# EasyEDA Pro project hardware_project.epro, board PCB4
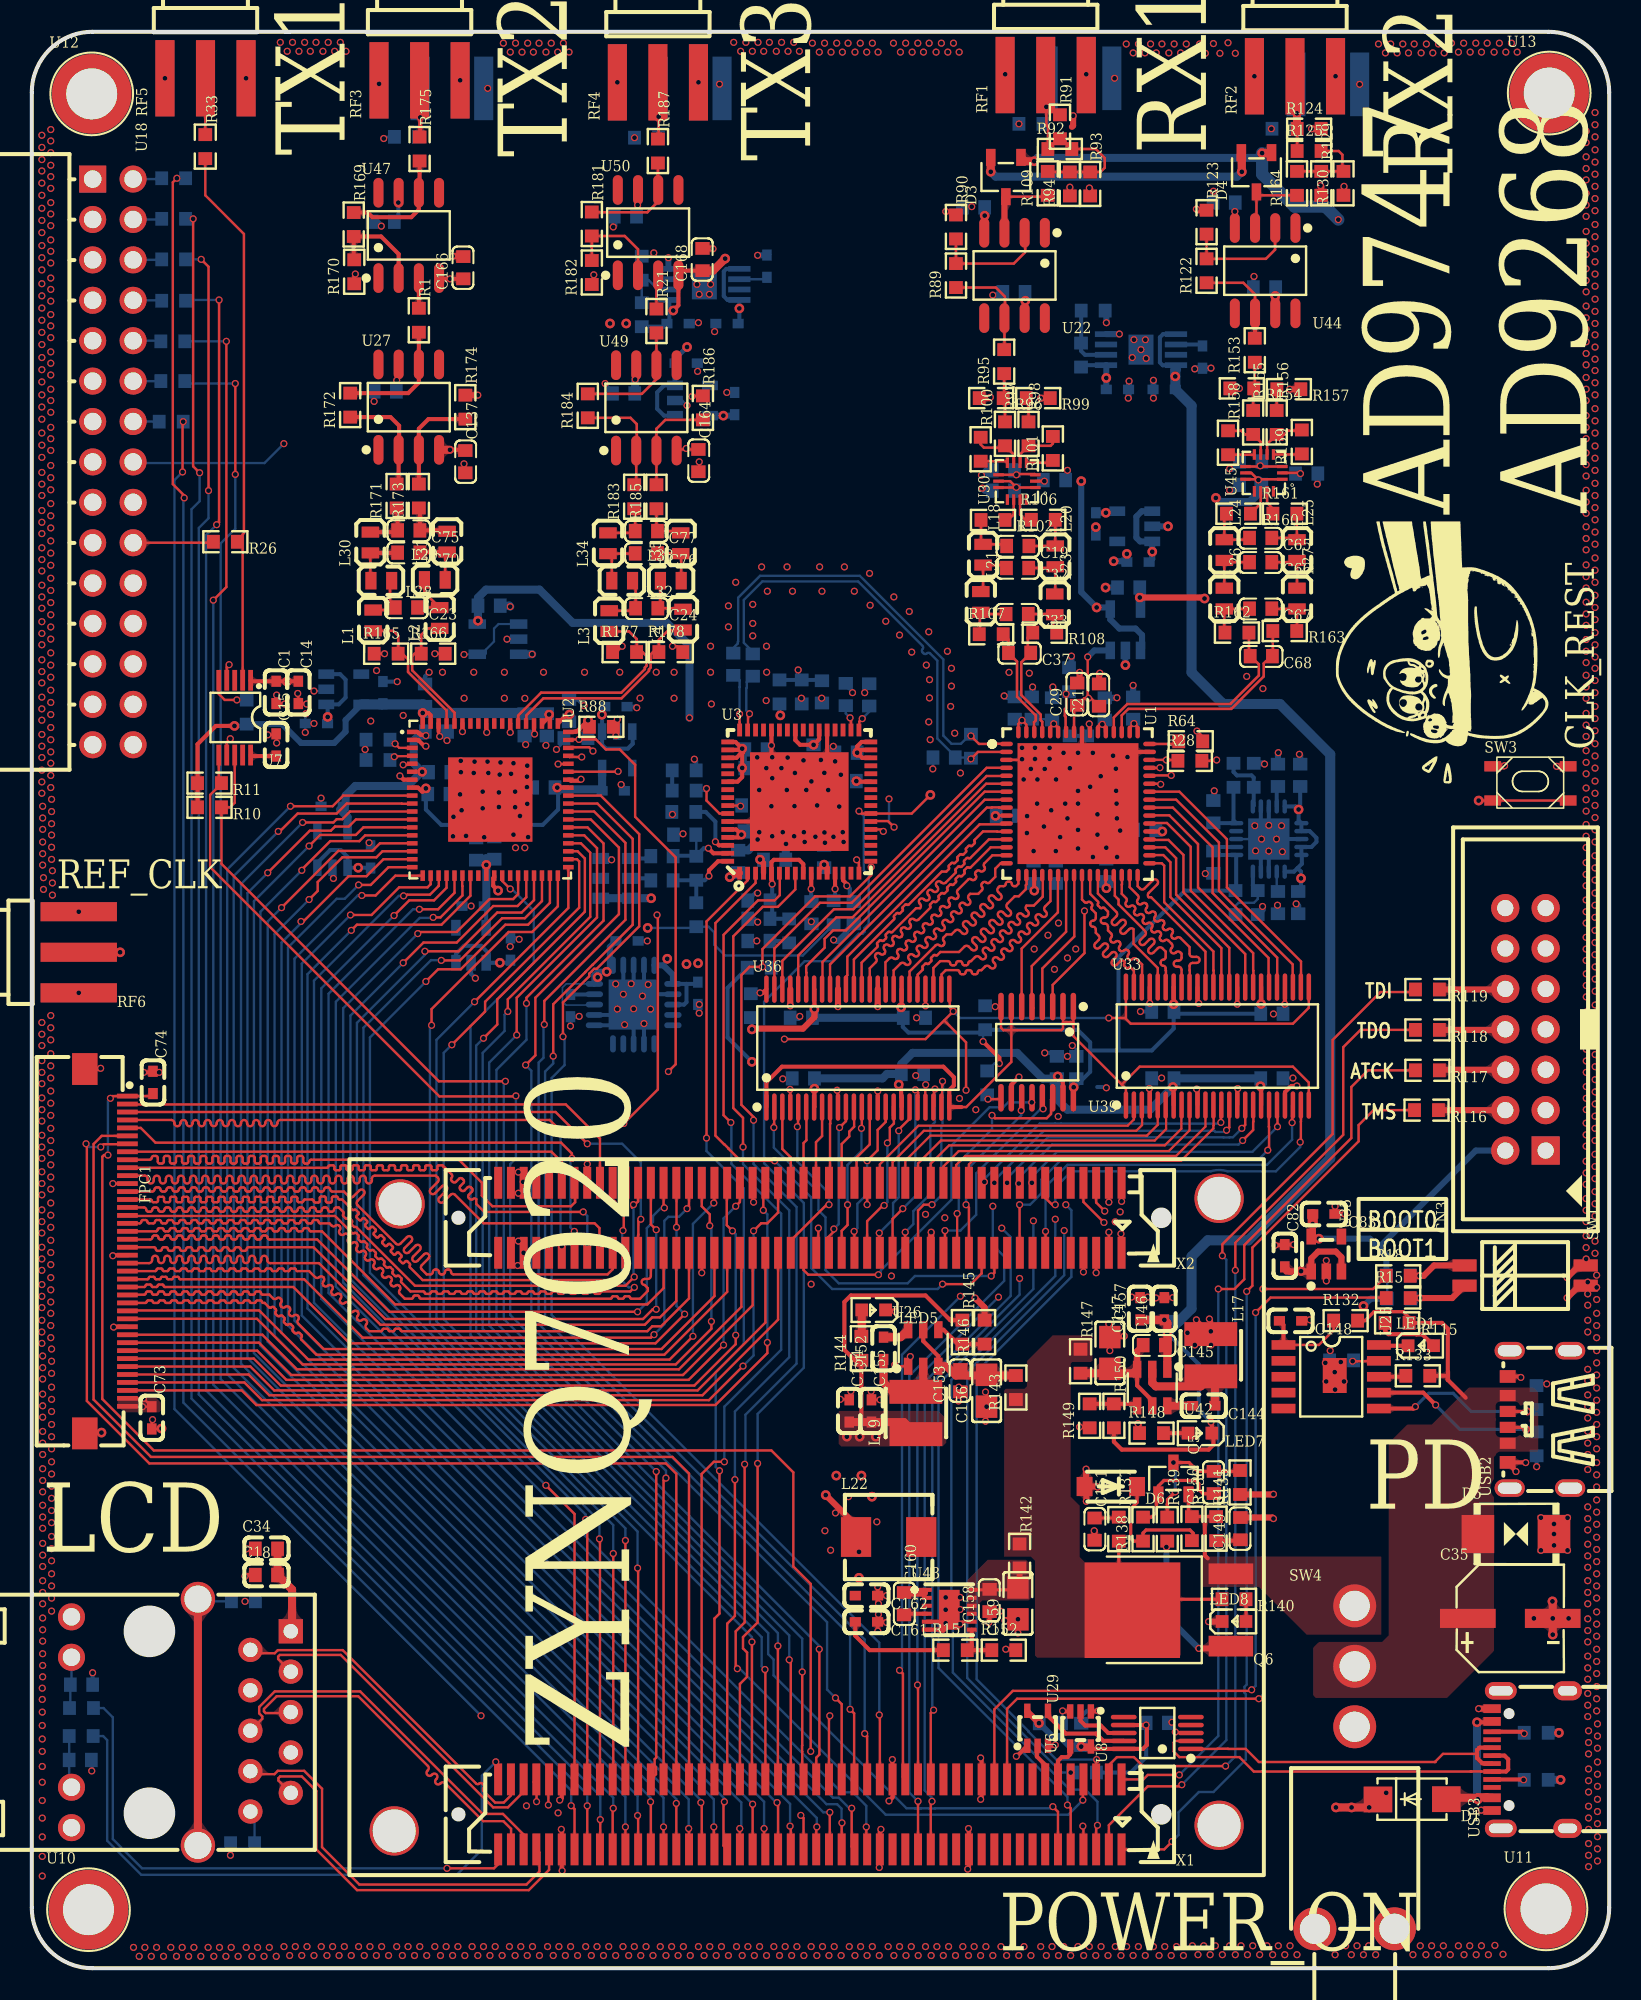
[diagram p7: board, top side]
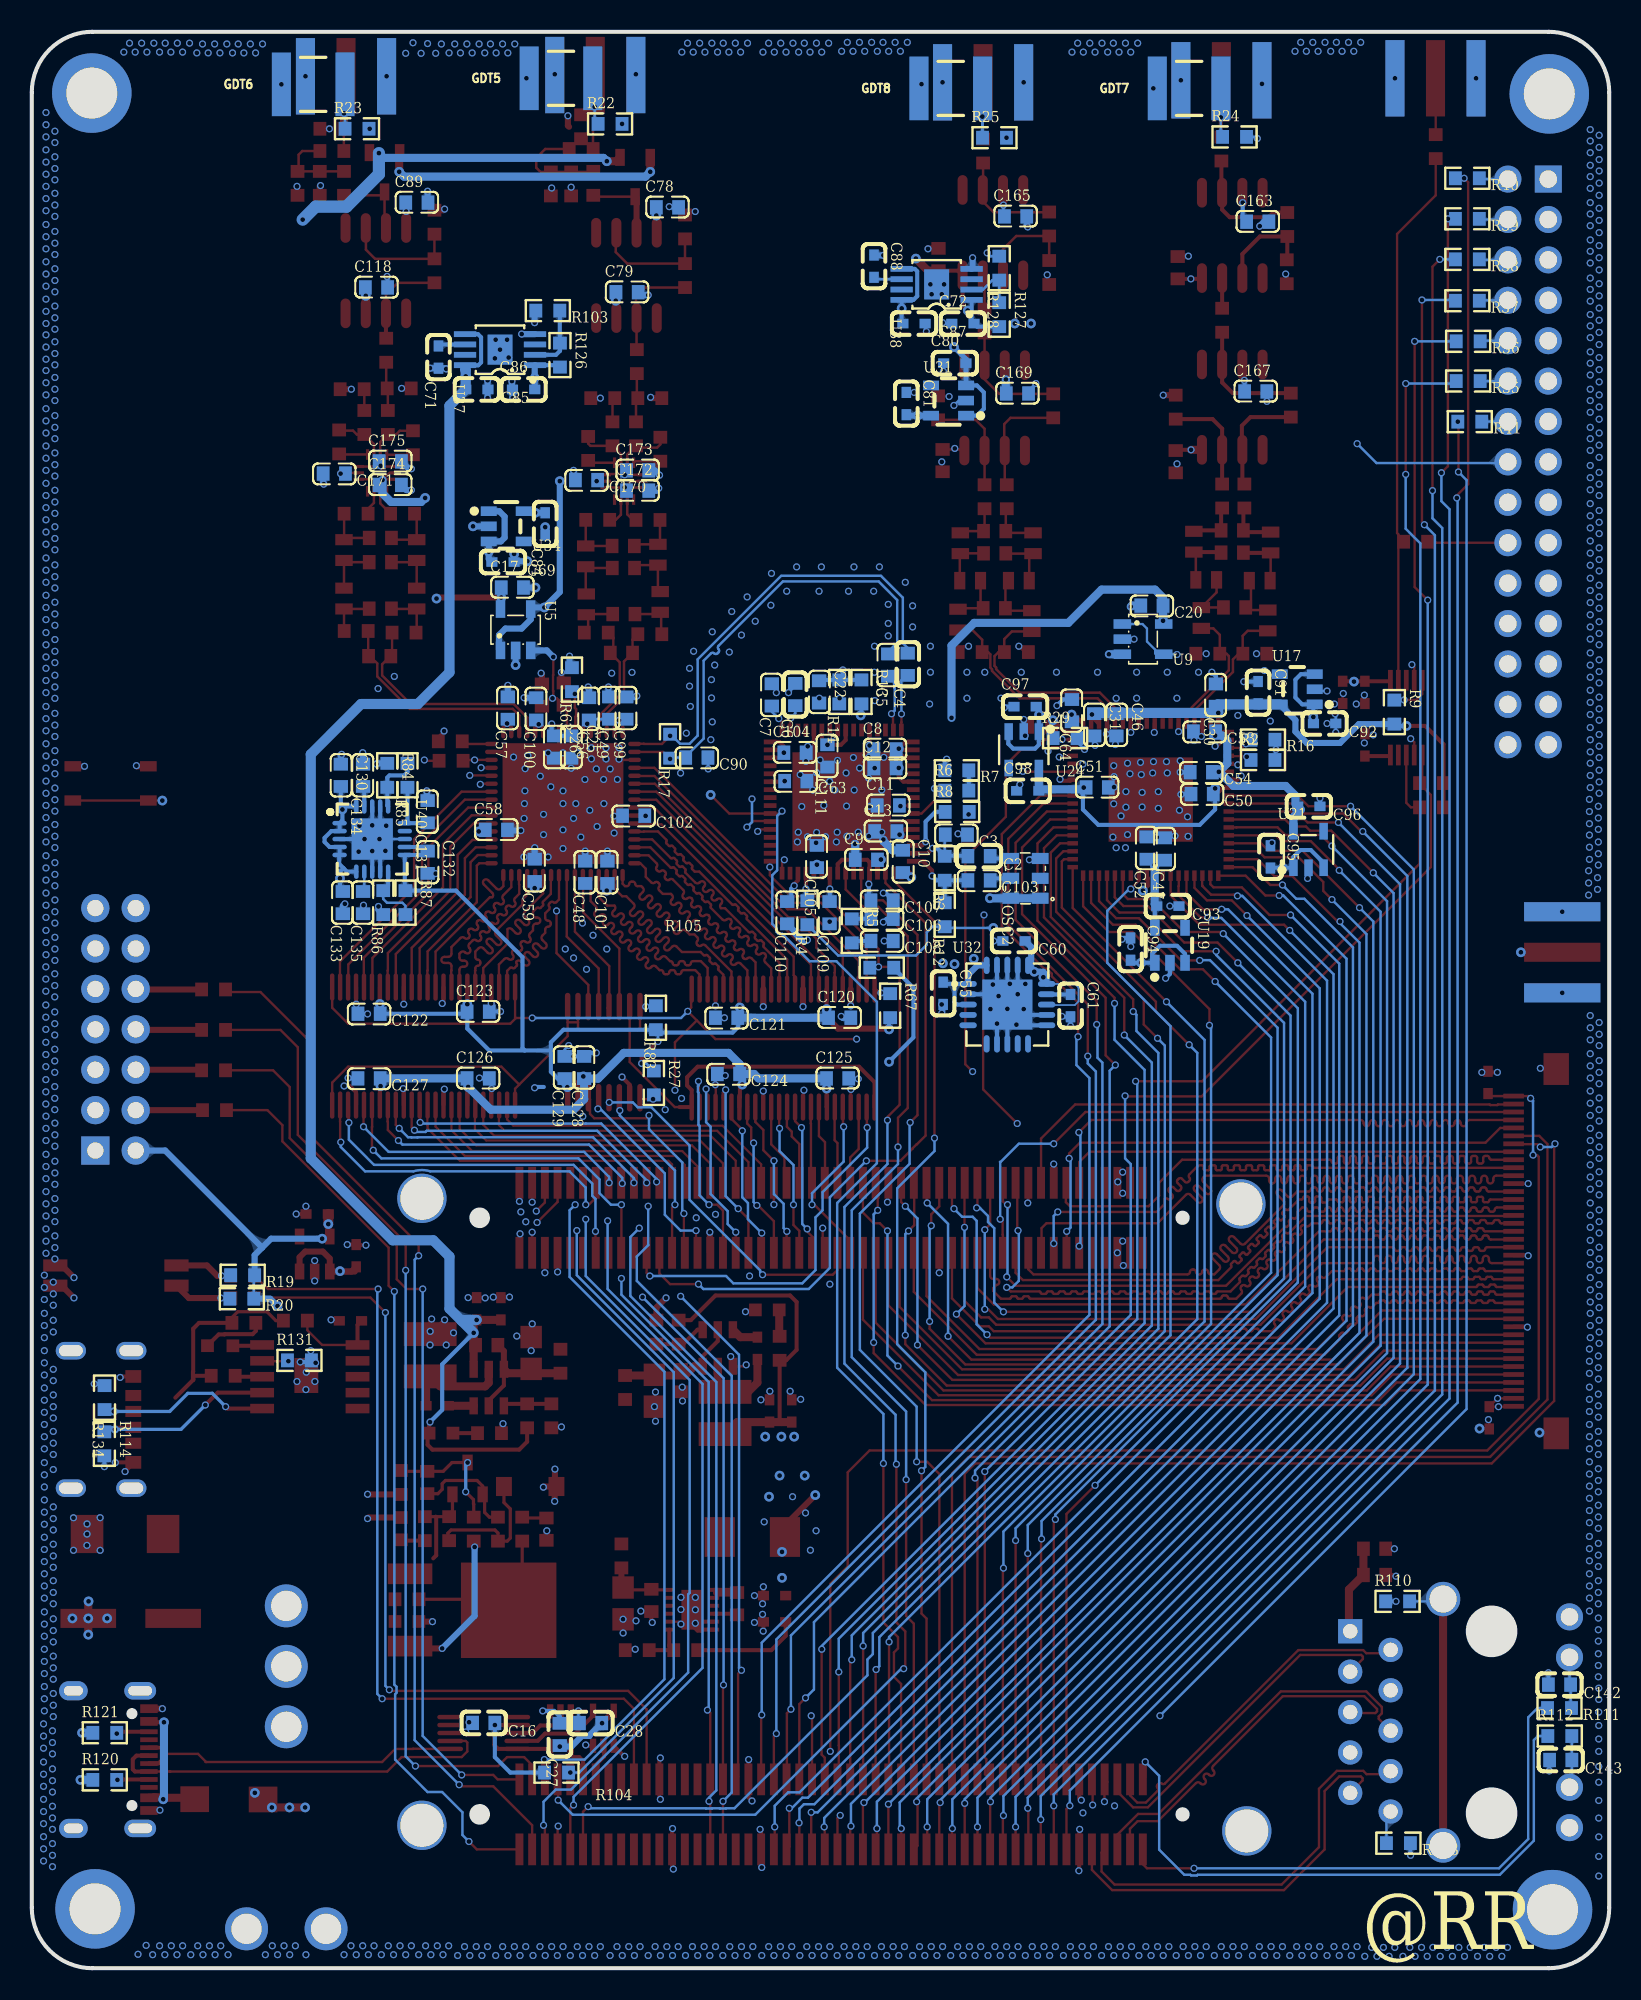
[diagram p8: board, bottom side, seen from below]

Outline 99.19 x 121.72 mm; copper layers: Top Layer, Inner1, Inner2, Inner3, Inner4, Bottom Layer. Coordinates in mm from the lower left corner of the outline.
Outline path: 0,117.91 0,3.81 arc(1.12,1.12) 3.81,0 95.38,0 arc(98.07,1.12) 99.19,3.81 99.19,117.91 arc(98.07,120.6) 95.38,121.72 3.81,121.72 arc(1.12,120.6) 0,117.91
Stack: Top Layer 0.035mm Outer layer thickness 1oz / Dielectric1 0.0994mm 3313 RC57% 4.2mil / Inner1 0.0152mm Inner layer thickness / Dielectric2 0.55mm 0.55mm H/H No copper / Inner2 0.0152mm Inner layer thickness / Dielectric3 0.1088mm 2116 RC54% 4.9mil / Inner3 0.0152mm Inner layer thickness / Dielectric4 0.55mm 0.55mm H/H No copper / Inner4 0.0152mm Inner layer thickness / Dielectric5 0.0994mm 3313 RC57% 4.2mil / Bottom Layer 0.035mm Outer layer thickness 1oz

## Design rules (mm)
net CLKP: DP6
net CLKN: DP6
net PHY1MDI3N: DP4
net PHY1MDI1N: DP2
net PHY1MDI3P: DP4
net PHY1MDI1P: DP2
net PHY1MDI2N: DP3
net PHY1MDI0N: DP1
net PHY1MDI2P: DP3
net PHY1MDI0P: DP1
spacing copperThickness1oz (default): track to track 0.102, other pairs 0.025 to 0.3
spacing safeClearance1: track to track 0.254, other pairs 0.152 to 0.3
spacing safeClearance2: track to track 0.152, other pairs 0.152 to 0.3
track width copperThickness1oz (default): min 0.025, default 0.254, max 2.54
track width GND: min 0.381, default 0.762, max 2.54
track width VCC: min 0.381, default 0.508, max 2.54
differential pair PHY (default): width min 0.102, default 0.119, max 2.54; gap min 0.102, default 0.203
differential pair differentialPair: width min 0.127, default 0.254, max 2.54; gap min 0.152, default 0.152
net GND uses copperRegion
pour e2939 uses copperRegion, copperThickness1oz
pour e542 uses copperRegion, copperThickness1oz
net PHY1MDI3N uses PHY
net PHY1MDI1N uses PHY
net PHY1MDI3P uses PHY
net PHY1MDI1P uses PHY
net PHY1MDI2N uses PHY
net PHY1MDI0N uses PHY
net PHY1MDI2P uses PHY
net PHY1MDI0P uses PHY
net PHY1AD1/LED1 uses default
net PHY1AD0/LED0 uses default
net VBUS uses copperRegion1, safeClearance1
net A-4.5V uses copperRegion
net A+2.5V uses copperRegion
net B35_L11_N        LCD_RST uses default
net B35_L7_N    LCD_BL uses default
net B34_L9_P       LCD_R6 uses default
net B34_L18_N      LCD_R1 uses default
net B34_L5_N       LCD_R3 uses default
net B34_L18_P      LCD_R0 uses default
net B34_L5_P       LCD_R2 uses default
net B34_L9_N       LCD_R7 uses default
net B34_L7_N      LCD_R4 uses default
net B34_L20_P       LCD_G2 uses default
net B34_L7_P      LCD_R5 uses default
net B34_L20_N       LCD_G3 uses default
net B34_L21_P     LCD_G0 uses default
net B34_L21_N     LCD_G1 uses default
net B34_L24_P       LCD_G6 uses default
net B34_L17_P     LCD_G4 uses default
net B34_L24_N       LCD_G7 uses default
net B34_L17_N     LCD_G5 uses default
net B34_L19_P       LCD_B2 uses default
net B34_L22_P     LCD_B0 uses default
net B34_L19_N       LCD_B3 uses default
net B34_L22_N     LCD_B1 uses default
net B34_L16_N     LCD_B4 uses default
net B34_L23_N       LCD_B6 uses default
net B34_L16_P     LCD_B5 uses default
net B34_L23_P       LCD_B7 uses default
net B34_L13_N      LCD_CLK uses default
net B34_L13_P    LCD_HSYNC uses default
net B34_L15_P       LCD_VSYNC uses default
net B34_L15_N       LCD_DE uses default
net 5.0V uses copperRegion

## Placement (name value [footprint] x y rotation side)
C1  10uF  [C0603#2]  15.36 80.19 270 top
C2  100nF  [C0603]  39.62 69.9 0 bottom
C3  100nF  [C0603]  41.05 71.25 0 bottom
C4  100nF  [C0603]  44.11 81.96 90 bottom
C5  100nF  [C0603]  45.33 81.91 90 bottom
C6  100nF  [C0603]  51.18 80.06 90 bottom
C7  100nF  [C0603]  52.65 80.04 90 bottom
C8  100nF  [C0603]  45.54 76.61 180 bottom
C9  100nF  [C0603]  46.71 69.67 180 bottom
C10  100nF  [C0603]  44.42 69.57 270 bottom
C11  100nF  [C0603]  45.33 73.09 180 bottom
C12  100nF  [C0603]  45.54 75.44 180 bottom
C13  100nF  [C0603]  45.49 71.46 180 bottom
C14  100nF  [C0603#2]  16.76 80.19 270 top
C15  220nF  [C0603#2]  15.36 76.89 270 top
C16  100n  [C0603]  70.77 15.42 0 bottom
C17  100nF  [C0603]  68.97 86.78 180 bottom
C18  100nF  [C0603]  14.75 24.72 0 top
C19  15pF  [C0603]  62 89.4 180 top
C20  100nF  [C0603]  28.75 85.65 0 bottom
C21  100nF  [C0603]  67.11 80.03 90 top
C22  100nF  [C0603]  49.68 80.22 270 bottom
C23  NC  [C0603]  23.56 85.53 180 top
C24  33pF  [C0603]  38.67 85.48 180 top
C25  100nF  [C0603]  65.27 76.76 270 bottom
C26  10uF  [C0603]  66.34 76.76 270 bottom
C27  100n  [C0603]  65.99 14.69 90 bottom
C28  100n  [C0603]  64.05 15.41 0 bottom
C29  10uF  [C0603]  65.73 80.09 90 top
C30  10uF  [C0603]  24.73 80.03 90 bottom
C31  100nF  [C0603]  32.39 78.16 270 bottom
C32  68pF  [C0603]  61.99 88.01 180 top
C33  130pF  [C0603]  61.96 85.12 180 top
C34  1uF  [C0603]  14.75 26.37 0 top
C35  220uF  [CAP-SMD_BD6.3-L6.6-W6.6-FD]  92.97 21.99 0 top
C37  11pF  [C0603]  62.11 82.68 180 top
C46  100nF  [C0603]  30.99 78.16 270 bottom
C47  10uF  [C0603]  27.94 70.35 90 bottom
C48  10uF  [C0603]  64.39 68.89 90 bottom
C49  10uF  [C0603]  62.88 79.21 90 bottom
C50  100nF  [C0603]  25.6 73.8 0 bottom
C51  100nF  [C0603]  32.2 74.22 180 bottom
C52  100nF  [C0603]  29.08 70.41 90 bottom
C53  100nF  [C0603]  25.44 77.73 0 bottom
C54  100nF  [C0603]  25.65 75.18 0 bottom
C55  10uF  [C0603#2]  41.88 61.28 270 bottom
C56  100nF  [C0603]  64.15 79.16 90 bottom
C57  100nF  [C0603]  69.25 79.21 90 bottom
C58  100nF  [C0603]  69.98 71.55 180 bottom
C59  100nF  [C0603]  67.56 69.01 90 bottom
C60  10uF  [C0603#2]  37.43 64.57 0 bottom
C61  100nF  [C0603#2]  33.87 60.51 270 bottom
C63  100nF  [C0603]  51.15 74.62 0 bottom
C64  100nF  [C0603]  33.78 79.05 90 bottom
C65  15pF  [C0603]  77.27 89.9 180 top
C66  68pF  [C0603]  77.27 88.38 180 top
C67  100pF  [C0603]  77.27 85.46 180 top
C68  11pF  [C0603]  77.31 82.47 180 top
C69  1uF  [C0603#2]  69.56 88.39 0 bottom
C70  NC  [C0603]  23.7 88.98 180 top
C71  10nF  [C0603#2]  73.61 101.27 90 bottom
C72  10uF  [C0603#2]  40.64 103.38 180 bottom
C73  100nF  [C0603#2]  7.54 34.59 270 top
C74  1uF  [C0603#2]  7.62 55.68 270 top
C75  NC  [C0603]  23.7 90.38 180 top
C76  47pF  [C0603]  38.64 88.94 180 top
C77  39pF  [C0603]  38.64 90.33 180 top
C78  100nF  [C0603]  59.22 110.68 180 bottom
C79  100nF  [C0603]  61.76 105.35 180 bottom
C80  1uF  [C0603#2]  41.15 100.89 180 bottom
C81  1uF  [C0603#2]  44.2 98.35 270 bottom
C82  1uF  [C0603#2]  78.79 44.78 270 top
C83  1uF  [C0603#2]  81.24 47.41 180 top
C84  1uF  [C0603#2]  66.91 90.79 90 bottom
C85  10uF  [C0603#2]  71.2 99.24 0 bottom
C86  10uF  [C0603#2]  68.26 99.24 180 bottom
C87  10uF  [C0603#2]  43.71 103.38 0 bottom
C88  10nF  [C0603#2]  46.23 106.98 270 bottom
C89  100nF  [C0603]  74.97 110.98 180 bottom
C90  100nF  [C0603]  57.37 76.1 0 bottom
C91  1uF  [C0603#2]  22.08 80.18 270 bottom
C92  1uF  [C0603#2]  17.89 78.24 0 bottom
C93  1uF  [C0603#2]  27.75 66.76 0 bottom
C94  1uF  [C0603#2]  30.1 64.06 270 bottom
C95  1uF  [C0603#2]  21.3 69.86 270 bottom
C96  1uF  [C0603#2]  18.89 73.03 0 bottom
C97  1uF  [C0603#2]  36.73 79.3 180 bottom
C98  1uF  [C0603#2]  36.56 74.01 180 bottom
C99  100nF  [C0603]  61.81 79.21 90 bottom
C100  100nF  [C0603]  67.47 79.16 90 bottom
C101  100nF  [C0603]  62.99 68.89 90 bottom
C102  100nF  [C0603]  61.34 72.44 0 bottom
C103  100nF  [C0603]  39.62 68.38 0 bottom
C104  100nF  [C0603]  51.2 76.4 180 bottom
C105  10uF  [C0603]  49.82 69.88 90 bottom
C106  680pF  [C0603]  45.72 65.96 0 bottom
C107  17pF  [C0603]  45.72 67.11 0 bottom
C108  3.51nF  [C0603]  45.72 64.57 0 bottom
C109  220nF  [C0603]  49.02 66.34 90 bottom
C110  220nF  [C0603]  51.69 66.34 90 bottom
C111  100nF  [C0603]  49.16 76.2 90 bottom
C118  100nF  [C0603]  77.51 105.65 180 bottom
C120  100nF  [C0603]  48.39 59.74 180 bottom
C121  100nF  [C0603]  55.5 59.74 0 bottom
C122  100nF  [C0603]  77.98 60 0 bottom
C123  100nF  [C0603]  71.12 60.12 180 bottom
C124  100nF  [C0603]  55.38 56.21 0 bottom
C125  100nF  [C0603]  48.51 55.93 180 bottom
C126  100nF  [C0603]  71.12 55.93 180 bottom
C127  100nF  [C0603]  77.98 55.93 0 bottom
C128  100nF  [C0603]  64.46 56.62 90 bottom
C129  100nF  [C0603]  65.68 56.62 90 bottom
C130  10uF  [C0603]  79.76 74.98 270 bottom
C131  10uF  [C0603]  74.3 72.7 90 bottom
C132  10uF  [C0603]  74.3 69.52 270 bottom
C133  10uF  [C0603]  79.63 66.98 90 bottom
C134  10nF  [C0603]  78.36 74.98 90 bottom
C135  10nF  [C0603]  78.36 66.98 90 bottom
C137  100nF  [C0603]  27.26 94.7 270 top
C142  100nF  [C0603]  3.12 17.82 0 bottom
C143  100nF  [C0603]  3.05 13.09 0 bottom
C144  100nF  [C0603#2]  73.69 35.35 180 top
C145  10uF  [C0603]  70.58 39.16 180 top
C146  22uF  [C0603#2]  71.22 41.45 90 top
C147  22uF  [C0603#2]  69.69 41.45 90 top
C148  1uF  [C0603#2]  79.15 40.69 180 top
C149  10nF  [C0603]  75.99 27.63 90 top
C150  100nF  [C0603]  74.33 30.53 90 top
C151  10nF  [C0603]  66.83 27.6 270 top
C152  100nF  [C0603#2]  53.56 38.96 90 top
C153  100nF  [C0603]  58.39 36.93 90 top
C154  22uF  [C0603#2]  51.4 35.03 270 top
C155  22uF  [C0603#2]  52.8 35.03 270 top
C156  22uF  [C0805]  60.04 36.3 90 top
C157  22uF  [C0805]  67.79 38.67 270 top
C158  100nF  [C0603]  60.23 23.12 90 top
C159  22uF  [C0805]  62.01 22.93 90 top
C160  100nF  [C0603]  54.84 22.91 270 top
C161  22uF  [C0603#2]  52.48 21.77 180 top
C162  22uF  [C0603#2]  52.48 23.42 180 top
C163  100nF  [C0603]  22.1 109.78 180 bottom
C164  100nF  [C0603]  41.92 94.76 270 top
C165  100nF  [C0603]  37.33 110.12 180 bottom
C166  100nF  [C0603]  27.13 106.89 90 top
C167  100nF  [C0603]  22.22 99.11 180 bottom
C168  100nF  [C0603]  42.17 107.4 90 top
C169  100nF  [C0603]  37.21 98.98 180 bottom
C170  100nF  [C0603]  64.3 93.54 0 bottom
C171  100nF  [C0603]  80.17 93.95 0 bottom
C172  100nF  [C0603]  61.09 92.88 180 bottom
C173  100nF  [C0603]  61.09 94.15 180 bottom
C174  100nF  [C0603]  76.65 93.23 180 bottom
C175  100nF  [C0603]  76.65 94.71 180 bottom
CN3  LAIL-SI-2.54-2X7P-ZC  [IDC-TH_14P-P2.54-V-M-R2-C7-S2.54]  93.92 59.02 90 top
D1  SS34  [SMA_L4.3-W2.6-LS5.0-FD]  86.8 10.61 180 top
D3  BAV99,215  [SOT-23-3_L2.9-W1.6-P1.90-LS2.8-BR]  61.25 112.59 90 top
D4  BAV99,215  [SOT-23-3_L2.9-W1.6-P1.90-LS2.8-BR]  77.01 112.89 90 top
D5  SMBJ24CA  [SMB_L4.6-W3.6-LS5.3-BI]  93.32 27.29 0 top
D6  SMF20A  [SOD-123F_L2.8-W1.8-LS3.7-RD]  67.85 30.28 180 top
FPC1  AFC01-S40FCA-00  [FPC-SMD_AFC01-S40FCA-00]  4.67 45.07 270 top
GDT5  GDT_SG90  [ScopefunPackagesLibrary:GDT_SG]  65.91 118.8 0 bottom
GDT6  GDT_SG90  [ScopefunPackagesLibrary:GDT_SG]  81.49 118.41 0 bottom
GDT7  GDT_SG90  [ScopefunPackagesLibrary:GDT_SG]  26.42 118.16 0 bottom
GDT8  GDT_SG90  [ScopefunPackagesLibrary:GDT_SG]  41.4 118.16 0 bottom
L1  0  [IND-SMD_L1.8-W1.2]  21.46 84.72 90 top
L2  0  [IND-SMD_L1.8-W1.2]  25.65 84.87 90 top
L3  0  [IND-SMD_L1.8-W1.2]  36.31 84.68 90 top
L4  0  [IND-SMD_L1.8-W1.2]  40.95 84.77 90 top
L17  10uH  [IND-SMD_L3.0-W3.0]  74.14 38.53 270 top
L18  56nH  [IND-SMD_L1.8-W1.2]  59.82 88.85 270 top
L19  10uH  [IND-SMD_L3.0-W3.0]  55.59 34.9 90 top
L20  56nH  [IND-SMD_L1.8-W1.2]  64.36 88.75 270 top
L21  120nH  [IND-SMD_L1.8-W1.2]  59.67 85.88 270 top
L22  3.3uH  [IND-SMD_L5.5-W5.3_APS0530M3R3H]  53.88 27.1 0 top
L23  120nH  [IND-SMD_L1.8-W1.2]  64.32 85.73 270 top
L24  56nH  [IND-SMD_L1.8-W1.2]  74.98 89.14 270 top
L25  56nH  [IND-SMD_L1.8-W1.2]  79.56 89.14 270 top
L26  120nH  [IND-SMD_L1.8-W1.2]  74.98 86.09 270 top
L27  120nH  [IND-SMD_L1.8-W1.2]  79.56 86.09 270 top
L28  0  [IND-SMD_L1.8-W1.2]  21.97 87.22 180 top
L29  0  [IND-SMD_L1.8-W1.2]  25.34 87.27 0 top
L30  0  [IND-SMD_L1.8-W1.2]  21.29 89.62 90 top
L31  0  [IND-SMD_L1.8-W1.2]  26.12 89.67 90 top
L32  0  [IND-SMD_L1.8-W1.2]  37.12 87.22 180 top
L33  0  [IND-SMD_L1.8-W1.2]  40.18 87.22 0 top
L34  0  [IND-SMD_L1.8-W1.2]  36.23 89.57 90 top
L35  0  [IND-SMD_L1.8-W1.2]  40.8 89.57 90 top
LED1  XL-2012SURC  [LED0603-RD_WHITE]  87.34 39.13 0 top
LED5  NCD0603Y2  [LED0603-RD]  52.94 41.38 180 top
LED7  NCD0603Y2  [LED0603-RD]  73.45 33.63 180 top
LED8  NCD0603Y2  [LED0603-RD]  75.6 21.79 0 top
NOREF  -  [Pad_e7144]  74.66 8.98 90 top
NOREF#2  -  [Pad_e7143]  74.66 48.39 0 top
NOREF#3  -  [Pad_e7142]  23.16 48.04 90 top
NOREF#4  -  [Pad_e7141]  22.79 8.63 90 top
OSC2  50MHz  [OSC-SMD_6P-L3.2-W2.5-BL-1]  36.7 68.5 90 bottom
Q5  MMBT3906  [SOT-23-3_L2.9-W1.3-P1.90-LS2.4-BR]  71.79 30.78 270 top
Q6  NCE40P70K  [TO-252-2_L6.6-W6.1-P4.57-LS9.9-TL-CW]  72.11 22.52 180 top
R1  50  [R0603]  24.34 103.59 270 top
R2  50  [R0603]  21.77 75.95 180 bottom
R3  100  [R0603]  41.78 69.14 90 bottom
R4  22  [R0603]  50.42 66.34 90 bottom
R5  1.09K  [R0603]  47.62 65.2 270 bottom
R6  3.9K  [R0603]  41.02 74.02 180 bottom
R7  220  [R0603]  41.02 75.29 0 bottom
R8  5.1K  [R0603]  41 72.68 180 bottom
R9  10K  [R0603]  13.51 78.95 270 bottom
R10  4.7K  [R0603]  11.17 72.97 180 top
R11  4.7K  [R0603]  11.17 74.49 180 top
R12  0  [R0603]  41.78 66.22 90 bottom
R13  36K  [R0603]  47.02 80.22 270 bottom
R14  5K  [R0603]  48.41 80.22 90 bottom
R15  20K  [R0603]  85.92 42.12 0 top
R16  50  [R0603]  21.77 77.22 0 bottom
R17  100  [R0603]  59.05 76.81 90 bottom
R18  20K  [R0603]  85.92 43.52 0 top
R19  20K  [R0603]  85.93 43.56 0 bottom
R20  20K  [R0603]  85.98 42.08 0 bottom
R21  50  [R0603]  39.28 103.54 270 top
R22  0Ω  [R0603]  62.83 115.93 180 bottom
R23  0Ω  [R0603]  78.74 115.62 180 bottom
R24  0Ω  [R0603]  23.56 115.11 180 bottom
R25  0Ω  [R0603]  38.65 115.06 180 bottom
R26  0Ω  [R0603]  12.17 89.66 180 top
R27  4.7K  [R0603]  60.07 55.65 270 bottom
R28  10K  [R0603]  72.82 75.89 0 top
R29  10K  [R0603]  34.21 77.32 180 bottom
R33  0Ω  [R0603]  10.91 114.5 270 top
R35  100  [R0603]  8.87 99.76 0 bottom
R36  100  [R0603]  8.87 102.26 0 bottom
R37  100  [R0603]  8.92 104.81 0 bottom
R38  100  [R0603]  8.92 107.41 0 bottom
R39  100  [R0603]  8.92 109.96 0 bottom
R40  100  [R0603]  8.92 112.51 0 bottom
R41  100  [R0603]  8.77 97.21 0 bottom
R63  10K  [R0603]  65.22 80.99 90 bottom
R64  10K  [R0603]  72.87 77.12 0 top
R67  4.7K  [R0603]  45.21 60.5 270 bottom
R83  4.7K  [R0603]  59.94 59.74 90 bottom
R84  1.6k  [R0603]  76.83 74.98 270 bottom
R85  2K  [R0603]  75.56 74.98 90 bottom
R86  1.6k  [R0603]  77.09 66.98 90 bottom
R87  2K  [R0603]  75.69 66.98 270 bottom
R88  10K  [R0603]  35.81 78.03 0 top
R89  0  [R0603]  58.11 106.4 90 top
R90  NC  [R0603]  58.11 109.45 270 top
R91  75  [R0603]  64.65 115.75 270 top
R92  120  [R0603]  64.64 114.35 0 top
R93  75  [R0603]  66.55 112.16 270 top
R94  49.9  [R0603]  65.27 112.16 90 top
R95  0  [R0603]  61.14 100.99 90 top
R96  62  [R0603]  60.33 98.69 180 top
R97  191  [R0603]  61.19 96.45 270 top
R98  191  [R0603]  62.67 96.45 270 top
R99  27.7  [R0603]  63.28 98.69 180 top
R100  200  [R0603]  59.66 95.48 270 top
R101  200  [R0603]  64.2 95.53 90 top
R102  24  [R0603]  60.44 91.03 180 top
R103  10K  [R0603]  66.74 104.19 0 bottom
R104  10K  [R0603]  66.19 12.3 0 bottom
R105  10K  [R0603]  45.74 62.89 180 bottom
R106  24  [R0603]  63.6 91.04 0 top
R107  0  [R0603]  60.33 83.85 0 top
R108  0  [R0603]  63.69 83.95 180 top
R109  120  [R0603]  63.88 112.19 90 top
R110  1  [R0603]  13.3 23.06 180 bottom
R111  330  [R0603]  3.12 16.35 0 bottom
R112  240  [R0603]  3.1 14.59 180 bottom
R113  0  [R0603]  13.25 7.86 0 bottom
R114  5.1kΩ  [R0603]  94.62 32.96 270 bottom
R115  20K  [R0603]  85.85 40.56 180 top
R116  33R  [R0603]  87.7 53.94 180 top
R117  33R  [R0603]  87.76 56.44 180 top
R118  33R  [R0603]  87.76 58.98 180 top
R119  33R  [R0603]  87.76 61.52 180 top
R120  5.1K  [R0603]  94.6 11.84 180 bottom
R121  5.1K  [R0603]  94.6 14.8 180 bottom
R122  0  [R0603]  73.87 106.69 90 top
R123  NC  [R0603]  73.87 109.75 270 top
R124  75  [R0603]  80.32 115.62 0 top
R125  120  [R0603]  80.32 114.22 0 top
R126  12K  [R0603]  65.98 101.4 270 bottom
R127  27K  [R0603]  38.35 103.94 270 bottom
R128  9.1K  [R0603]  38.35 106.86 90 bottom
R129  75  [R0603]  81.08 112.19 270 top
R130  49.9  [R0603]  82.48 112.19 90 top
R131  NC  [R0603]  82.36 38.21 180 bottom
R132  1K  [R0603]  82.61 40.7 0 top
R133  10K  [R0603]  87.15 37.24 0 top
R134  5.1kΩ  [R0603]  94.61 35.87 90 bottom
R135  33  [R0603]  74.47 27.63 270 top
R136  100K  [R0603]  72.95 27.63 270 top
R137  33  [R0603]  68.35 27.6 270 top
R138  1K  [R0603]  69.87 27.6 90 top
R139  1K  [R0603]  71.4 27.6 270 top
R140  33K  [R0603]  75.6 23.19 180 top
R141  10K  [R0603]  75.98 30.53 90 top
R142  0Ω  [R0603]  62.11 25.91 270 top
R143  0Ω  [R0603]  61.88 36.5 90 top
R144  4.3K  [R0603]  52.16 38.96 90 top
R145  102K  [R0603]  58.51 39.98 270 top
R146  24K  [R0603]  59.91 39.98 90 top
R147  0Ω  [R0603]  65.94 38.15 270 top
R148  4.3K  [R0603]  70.41 33.63 0 top
R149  180K  [R0603]  66.52 34.72 90 top
R150  24K  [R0603]  68.04 34.72 270 top
R151  51K  [R0603]  58.07 19.99 0 top
R152  10K  [R0603]  61.12 19.99 0 top
R153  0  [R0603]  76.9 101.7 90 top
R154  62  [R0603]  76.09 99.3 180 top
R155  191  [R0603]  76.8 97.16 270 top
R156  191  [R0603]  78.28 97.16 270 top
R157  27.7  [R0603]  79.04 99.25 180 top
R158  200  [R0603]  75.22 95.89 270 top
R159  200  [R0603]  79.86 95.94 90 top
R160  24  [R0603]  75.87 91.43 180 top
R161  24  [R0603]  78.8 91.43 0 top
R162  0  [R0603]  75.78 83.95 0 top
R163  0  [R0603]  78.79 84.05 180 top
R164  120  [R0603]  79.56 112.19 90 top
R165  49.9  [R0603]  22.28 82.63 0 top
R166  49.9  [R0603]  25.24 82.63 0 top
R169  1K  [R0603]  20.24 109.61 270 top
R170  1K  [R0603]  20.27 106.63 90 top
R171  250  [R0603]  22.94 92.54 90 top
R172  300  [R0603]  20.02 98.25 90 top
R173  50  [R0603]  24.34 92.54 90 top
R174  100  [R0603]  27.26 98.12 270 top
R175  50  [R0603]  24.38 114.35 270 top
R177  49.9  [R0603]  37.27 82.73 0 top
R178  49.9  [R0603]  40.18 82.73 0 top
R181  1K  [R0603]  35.21 109.64 270 top
R182  1K  [R0603]  35.21 106.59 90 top
R183  250  [R0603]  37.88 92.49 90 top
R184  300  [R0603]  34.96 98.21 90 top
R185  50  [R0603]  39.28 92.49 90 top
R186  100  [R0603]  42.2 98.08 270 top
R187  50  [R0603]  39.37 114.22 270 top
RF1  -  [SMA-SMD_BWSMA-KE-P001]  63.75 119 90 top
RF2  -  [SMA-SMD_BWSMA-KE-P001]  79.43 118.92 90 top
RF3  -  [SMA-SMD_BWSMA-KE-P001]  24.38 118.67 90 top
RF4  -  [SMA-SMD_BWSMA-KE-P001]  39.37 118.54 90 top
RF5  -  [SMA-SMD_BWSMA-KE-P001]  10.92 118.8 90 top
RF6  -  [SMA-SMD_BWSMA-KE-P001]  2.95 63.86 180 top
RJ1  HR911130A  [RJ45-TH_HR911130A]  9.39 15.46 90 top
SW1  DSHP02TSGER  [SW-SMD_DSHP02TSGER]  93.9 43.54 270 top
SW3  -  [4脚平脚开关]  94.23 74.47 0 top
SW4  MT-0-102-C004-N004-RS  [SW-TH_MT-0-102-C004-N004-RS]  83.18 12.62 0 top
U1  AD9268BCPZ-125  [LFCSP-64_L9.0-W9.0-P0.50-BL-EP7.5]  65.79 73.2 270 top
U2  AD9747BCPZRL  [LFCSP-72_L10.0-W9.8-P0.50-LS10.2-BL-EP5.5]  28.83 73.46 270 top
U3  AD9516-3BCPZ-REEL7  [LFCSP-64_L9.0-W9.0-P0.50-BL-EP6.2]  48.26 73.33 0 top
U5  OPA320AIDBVR  [SOT-23-5_L3.0-W1.7-P0.95-LS2.8-BR]  68.77 84.13 270 bottom
U6  74LVC1G125GW-TP  [SC-70-5_L2.1-W1.3-P0.65-LS2.1-BR]  65.94 15.04 90 top
U7  DAC60501MDGSR  [VSSOP-10_L3.0-W3.0-P0.50-LS4.9-BL]  12.76 78.61 180 top
U8  CH340X  [MSOP-10_L3.0-W3.0-P0.50-LS5.0-BL]  70.77 14.78 90 top
U9  OPA320AIDBVR  [SOT-23-5_L3.0-W1.7-P0.95-LS2.8-BR]  29.31 83.54 0 bottom
U10  M3x10+6Cu  [SMD_L4.7-W4.7-D3.0]  3.56 3.68 0 top
U11  M3x10+6Cu  [SMD_L4.7-W4.7-D3.0]  95.21 3.73 0 top
U12  M3x10+6Cu  [SMD_L4.7-W4.7-D3.0]  3.77 117.82 0 top
U13  M3x10+6Cu  [SMD_L4.7-W4.7-D3.0]  95.42 117.87 0 top
U17  TPS7A2033PDBVR  [SOT-23-5_L2.9-W1.6-P0.95-LS2.8-BR]  19.62 80.39 180 bottom
U18  HC-PM254-8.5H-2x15PW  [HDR-TH_30P-P2.54-H-F-R2-C15-W8.5]  5.1 94.68 270 top
U19  TPS7A2033PDBVR  [SOT-23-5_L2.9-W1.6-P0.95-LS2.8-BR]  27.62 64.3 270 bottom
U21  TPS7A2018PDBVR  [TSOT-23-5_L2.9-W1.6-P0.95-LS2.8-BL]  18.91 70.32 180 bottom
U22  LMH6609MAX/NOPB  [SOP-8_L4.9-W3.9-P1.27-LS6.0-BL]  61.8 106.4 180 top
U24  TPS7A2018PDBVR  [TSOT-23-5_L2.9-W1.6-P0.95-LS2.8-BL]  36.81 76.59 0 bottom
U25  CH224K  [ESSOP-10_L4.9-W3.9-P1.0-LS6.0-TL-EP]  81.71 37.18 270 top
U26  LMR51420XDDCR  [SOT-23-6_L2.9-W1.6-P0.95-LS2.8-BL]  56.05 38.98 0 top
U27  LMH6609MAX/NOPB  [SOP-8_L4.9-W3.9-P1.27-LS6.0-BL]  23.7 98.12 0 top
U29  74LVC1G125GW-TP  [SC-70-5_L2.1-W1.3-P0.65-LS2.1-BR]  63.25 15.08 270 top
U30  LMH6554LEE/NOPB  [UQFN-14_L2.5-W2.5-P0.40-BL]  61.94 93.47 90 top
U31  TPS7A2045PDBVR  [SOT-23-5_L2.9-W1.6-P0.95-LS2.8-BR]  41.54 98.54 180 bottom
U32  TPS7A4701RGWR  [VQFN-20_L5.0-W5.0-P0.65-TL-EP]  37.84 60.57 180 bottom
U33  SN74AVC16T245DGGR  [TSSOP-48_L12.6-W6.2-P0.50-LS8.1-BL]  74.55 57.96 0 top
U34  TPS7A2025PDBVR  [SOT-23-5_L2.9-W1.6-P0.95-LS2.8-BR]  69.35 90.63 0 bottom
U35  TPS7A2033PDBVR  [SOT-23-5_L2.9-W1.6-P0.95-LS2.8-BR]  81.4 44.89 270 top
U36  SN74AVC16T245DGGR  [TSSOP-48_L12.6-W6.2-P0.50-LS8.1-BL]  51.94 57.84 0 top
U37  TPS7A3001DGNT  [HVSSOP-8_L3.0-W3.0-P0.65-LS4.9-BL-EP_DGN0008D]  69.75 101.74 90 bottom
U38  TPS7A3001DGNT  [HVSSOP-8_L3.0-W3.0-P0.65-LS4.9-BL-EP_DGN0008D]  42.29 105.84 90 bottom
U39  SN74AVC4T774PWR  [TSSOP-16_L5.0-W4.4-P0.65-LS6.4-BL]  63.22 57.58 180 top
U40  TPS7A8801RTJR  [LFCSP-20_L4.0-W4.0-P0.50-BL-EP]  77.78 70.98 270 bottom
U42  LMR51420XDDCR  [SOT-23-6_L2.9-W1.6-P0.95-LS2.8-BL]  70.45 36.5 180 top
U43  LMR51450SDRRR  [WSON-12_L3.0-W3.0-P0.50-TL-EP-2]  57.69 22.53 0 top
U44  LMH6609MAX/NOPB  [SOP-8_L4.9-W3.9-P1.27-LS6.0-BL]  77.55 106.7 180 top
U45  LMH6554LEE/NOPB  [UQFN-14_L2.5-W2.5-P0.40-BL]  77.48 93.99 90 top
U47  LMH6609MAX/NOPB  [SOP-8_L4.9-W3.9-P1.27-LS6.0-BL]  23.7 108.92 0 top
U49  LMH6609MAX/NOPB  [SOP-8_L4.9-W3.9-P1.27-LS6.0-BL]  38.64 98.08 0 top
U50  LMH6609MAX/NOPB  [SOP-8_L4.9-W3.9-P1.27-LS6.0-BL]  38.75 109.09 0 top
USB2  TYPE-C 6P  [TYPE-C-SMD_TYPE-C-6P]  94.77 34.5 90 top
USB3  TYPE-C 16PIN 2MD(073)  [USB-C-SMD_TYPE-C-6PIN-2MD-073]  94.2 13.11 90 top
X1  3710板对板连接器 公座  [CONN-SMD_100P-P0.80_61083-101402LF]  48.93 9.67 180 top
X2  3710板对板连接器 公座  [CONN-SMD_100P-P0.80_61083-101402LF]  48.93 47.17 180 top

## Footprints (pads in the part's own frame, mm; a bottom-side part is the same pattern mirrored in y, then rotated)
4脚平脚开关
  rect 1.05x0.65 smd: 1(-2.375,1.075) 1(2.375,1.075) 2(-2.375,-1.075) 2(2.375,-1.075)
C0603
  rect 0.8x0.9 smd: 1(-0.7,0) 2(0.7,0)
C0603#2
  rect 0.7x0.6 smd: 1(-0.7,0) 2(0.7,0)
C0805
  rect 1.41x1.35 smd: 1(-1,0) 2(1,0)
CAP-SMD_BD6.3-L6.6-W6.6-FD
  rect 3.5x1.2 smd: 1(-2.67,0) 2(2.67,0)
CONN-SMD_100P-P0.80_61083-101402LF
  rect 0.5x2 smd: 1(-19.6,2.2) 2(-19.6,-2.2) 3(-18.8,2.2) 4(-18.8,-2.2) 5(-18,2.2) 6(-18,-2.2) 7(-17.2,2.2) 8(-17.2,-2.2) 9(-16.4,2.2) 10(-16.4,-2.2) 11(-15.6,2.2) 12(-15.6,-2.2) 13(-14.8,2.2) 14(-14.8,-2.2) 15(-14,2.2) 16(-14,-2.2) 17(-13.2,2.2) 18(-13.2,-2.2) 19(-12.4,2.2) 20(-12.4,-2.2) 21(-11.6,2.2) 22(-11.6,-2.2) 23(-10.8,2.2) 24(-10.8,-2.2) 25(-10,2.2) 26(-10,-2.2) 27(-9.2,2.2) 28(-9.2,-2.2) 29(-8.4,2.2) 30(-8.4,-2.2) 31(-7.6,2.2) 32(-7.6,-2.2) 33(-6.8,2.2) 34(-6.8,-2.2) 35(-6,2.2) 36(-6,-2.2) 37(-5.2,2.2) 38(-5.2,-2.2) 39(-4.4,2.2) 40(-4.4,-2.2) 41(-3.6,2.2) 42(-3.6,-2.2) 43(-2.8,2.2) 44(-2.8,-2.2) 45(-2,2.2) 46(-2,-2.2) 47(-1.2,2.2) 48(-1.2,-2.2) 49(-0.4,2.2) 50(-0.4,-2.2) 51(0.4,2.2) 52(0.4,-2.2) 53(1.2,2.2) 54(1.2,-2.2) 55(2,2.2) 56(2,-2.2) 57(2.8,2.2) 58(2.8,-2.2) 59(3.6,2.2) 60(3.6,-2.2) 61(4.4,2.2) 62(4.4,-2.2) 63(5.2,2.2) 64(5.2,-2.2) 65(6,2.2) 66(6,-2.2) 67(6.8,2.2) 68(6.8,-2.2) 69(7.6,2.2) 70(7.6,-2.2) 71(8.4,2.2) 72(8.4,-2.2) 73(9.2,2.2) 74(9.2,-2.2) 75(10,2.2) 76(10,-2.2) 77(10.8,2.2) 78(10.8,-2.2) 79(11.6,2.2) 80(11.6,-2.2) 81(12.4,2.2) 82(12.4,-2.2) 83(13.2,2.2) 84(13.2,-2.2) 85(14,2.2) 86(14,-2.2) 87(14.8,2.2) 88(14.8,-2.2) 89(15.6,2.2) 90(15.6,-2.2) 91(16.4,2.2) 92(16.4,-2.2) 93(17.2,2.2) 94(17.2,-2.2) 95(18,2.2) 96(18,-2.2) 97(18.8,2.2) 98(18.8,-2.2) 99(19.6,2.2) 100(19.6,-2.2)
ESSOP-10_L4.9-W3.9-P1.0-LS6.0-TL-EP
  rect 0.6x1.5 smd: 1(-2,-3) 2(-1,-3) 3(0,-3) 4(1,-3) 5(2,-3) 6(2,3) 7(1,3) 8(0,3) 9(-1,3) 10(-2,3)
  rect 2.2x1.5 smd: 11(-0.078,0.221)
FPC-SMD_AFC01-S40FCA-00
  rect 0.3x1.3 smd: 1(9.75,1.34) 2(9.25,1.34) 3(8.75,1.34) 4(8.25,1.34) 5(7.75,1.34) 6(7.25,1.34) 7(6.75,1.34) 8(6.25,1.34) 9(5.75,1.34) 10(5.25,1.34) 11(4.75,1.34) 12(4.25,1.34) 13(3.75,1.34) 14(3.25,1.34) 15(2.75,1.34) 16(2.25,1.34) 17(1.75,1.34) 18(1.25,1.34) 19(0.75,1.34) 20(0.25,1.34) 21(-0.25,1.34) 22(-0.75,1.34) 23(-1.25,1.34) 24(-1.75,1.34) 25(-2.25,1.34) 26(-2.75,1.34) 27(-3.25,1.34) 28(-3.75,1.34) 29(-4.25,1.34) 30(-4.75,1.34) 31(-5.25,1.34) 32(-5.75,1.34) 33(-6.25,1.34) 34(-6.75,1.34) 35(-7.25,1.34) 36(-7.75,1.34) 37(-8.25,1.34) 38(-8.75,1.34) 39(-9.25,1.339) 40(-9.75,1.34)
  rect 2x1.6 smd: 41(-11.45,-1.34) 42(11.45,-1.34)
HDR-TH_30P-P2.54-H-F-R2-C15-W8.5
  rect 1.7x1.7 hole 1.1: 1(-17.78,-1.27)
  round 1.7 hole 1.1: 2(-17.78,1.27) 3(-15.24,-1.27) 4(-15.24,1.27) 5(-12.7,-1.27) 6(-12.7,1.27) 7(-10.16,-1.27) 8(-10.16,1.27) 9(-7.62,-1.27) 10(-7.62,1.27) 11(-5.08,-1.27) 12(-5.08,1.27) 13(-2.54,-1.27) 14(-2.54,1.27) 15(0,-1.27) 16(0,1.27) 17(2.54,-1.27) 18(2.54,1.27) 19(5.08,-1.27) 20(5.08,1.27) 21(7.62,-1.27) 22(7.62,1.27) 23(10.16,-1.27) 24(10.16,1.27) 25(12.7,-1.27) 26(12.7,1.27) 27(15.24,-1.27) 28(15.24,1.27) 29(17.78,-1.27) 30(17.78,1.27)
HVSSOP-8_L3.0-W3.0-P0.65-LS4.9-BL-EP_DGN0008D
  rect 0.364x1.4 smd: 1(-0.975,-2.2) 2(-0.325,-2.2) 3(0.325,-2.2) 4(0.975,-2.2) 5(0.975,2.2) 6(0.325,2.2) 7(-0.325,2.2) 8(-0.975,2.2)
  rect 1.89x1.57 smd: 9(0,0)
IDC-TH_14P-P2.54-V-M-R2-C7-S2.54
  rect 1.778x1.778 hole 1.02: 1(-7.62,-1.27)
  round 1.778 hole 1.02: 2(-7.62,1.27) 3(-5.08,-1.27) 4(-5.08,1.27) 5(-2.54,-1.27) 6(-2.54,1.27) 7(0,-1.27) 8(0,1.27) 9(2.54,-1.27) 10(2.54,1.27) 11(5.08,-1.27) 12(5.08,1.27) 13(7.62,-1.27) 14(7.62,1.27)
IND-SMD_L1.8-W1.2
  rect 0.7x1.1 smd: 1(-0.652,0) 2(0.652,0)
IND-SMD_L3.0-W3.0
  rect 1.5x3.32 smd: 1(1.328,0) 2(-1.328,0)
IND-SMD_L5.5-W5.3_APS0530M3R3H
  rect 1.9x2.5 smd: 1(-2.05,0) 2(2.05,0)
LED0603-RD
  rect 0.8x0.8 smd: 1(-0.749,0) 2(0.749,0)
LED0603-RD_WHITE
  rect 0.8x0.8 smd: 1(-0.799,-0.004) 2(0.799,0.004)
LFCSP-20_L4.0-W4.0-P0.50-BL-EP
  oval 0.28x0.9 smd: 1(-1,-2.05) 2(-0.5,-2.05) 3(0,-2.05) 4(0.5,-2.05) 5(1,-2.05) 11(1,2.05) 12(0.5,2.05) 13(0,2.05) 14(-0.5,2.05) 15(-1,2.05)
  oval 0.9x0.28 smd: 6(2.05,-1) 7(2.05,-0.5) 8(2.05,0) 9(2.05,0.5) 10(2.05,1) 16(-2.05,1) 17(-2.05,0.5) 18(-2.05,0) 19(-2.05,-0.5) 20(-2.05,-1)
  rect 2.6x2.6 smd: 21(0,0)
LFCSP-64_L9.0-W9.0-P0.50-BL-EP6.2
  rect 0.3x0.8 smd: 1(-3.75,-4.5) 2(-3.25,-4.5) 3(-2.75,-4.5) 4(-2.25,-4.5) 5(-1.75,-4.5) 6(-1.25,-4.5) 7(-0.75,-4.5) 8(-0.25,-4.5) 9(0.25,-4.5) 10(0.75,-4.5) 11(1.25,-4.5) 12(1.75,-4.5) 13(2.25,-4.5) 14(2.75,-4.5) 15(3.25,-4.5) 16(3.75,-4.5) 33(3.75,4.5) 34(3.25,4.5) 35(2.75,4.5) 36(2.25,4.5) 37(1.75,4.5) 38(1.25,4.5) 39(0.75,4.5) 40(0.25,4.5) 41(-0.25,4.5) 42(-0.75,4.5) 43(-1.25,4.5) 44(-1.75,4.5) 45(-2.25,4.5) 46(-2.75,4.5) 47(-3.25,4.5) 48(-3.75,4.5)
  rect 0.8x0.3 smd: 17(4.5,-3.75) 18(4.5,-3.25) 19(4.5,-2.75) 20(4.5,-2.25) 21(4.5,-1.75) 22(4.5,-1.25) 23(4.5,-0.75) 24(4.5,-0.25) 25(4.5,0.25) 26(4.5,0.75) 27(4.5,1.25) 28(4.5,1.75) 29(4.5,2.25) 30(4.5,2.75) 31(4.5,3.25) 32(4.5,3.75) 49(-4.5,3.75) 50(-4.5,3.25) 51(-4.5,2.75) 52(-4.5,2.25) 53(-4.5,1.75) 54(-4.5,1.25) 55(-4.5,0.75) 56(-4.5,0.25) 57(-4.5,-0.25) 58(-4.5,-0.75) 59(-4.5,-1.25) 60(-4.5,-1.75) 61(-4.5,-2.25) 62(-4.5,-2.75) 63(-4.5,-3.25) 64(-4.5,-3.75)
  rect 6.2x6.2 smd: 65(-0.002,-0.001)
LFCSP-64_L9.0-W9.0-P0.50-BL-EP7.5
  oval 0.28x0.8 smd: 1(-3.75,-4.5) 2(-3.25,-4.5) 3(-2.75,-4.5) 4(-2.25,-4.5) 5(-1.75,-4.5) 6(-1.25,-4.5) 7(-0.75,-4.5) 8(-0.25,-4.5) 9(0.25,-4.5) 10(0.75,-4.5) 11(1.25,-4.5) 12(1.75,-4.5) 13(2.25,-4.5) 14(2.75,-4.5) 15(3.25,-4.5) 16(3.75,-4.5) 33(3.75,4.5) 34(3.25,4.5) 35(2.75,4.5) 36(2.25,4.5) 37(1.75,4.5) 38(1.25,4.5) 39(0.75,4.5) 40(0.25,4.5) 41(-0.25,4.5) 42(-0.75,4.5) 43(-1.25,4.5) 44(-1.75,4.5) 45(-2.25,4.5) 46(-2.75,4.5) 47(-3.25,4.5) 48(-3.75,4.5)
  oval 0.8x0.28 smd: 17(4.5,-3.75) 18(4.5,-3.25) 19(4.5,-2.75) 20(4.5,-2.25) 21(4.5,-1.75) 22(4.5,-1.25) 23(4.5,-0.75) 24(4.5,-0.25) 25(4.5,0.25) 26(4.5,0.75) 27(4.5,1.25) 28(4.5,1.75) 29(4.5,2.25) 30(4.5,2.75) 31(4.5,3.25) 32(4.5,3.75) 49(-4.5,3.75) 50(-4.5,3.25) 51(-4.5,2.75) 52(-4.5,2.25) 53(-4.5,1.75) 54(-4.5,1.25) 55(-4.5,0.75) 56(-4.5,0.25) 57(-4.5,-0.25) 58(-4.5,-0.75) 59(-4.5,-1.25) 60(-4.5,-1.75) 61(-4.5,-2.25) 62(-4.5,-2.75) 63(-4.5,-3.25) 64(-4.5,-3.75)
  rect 7.6x7.6 smd: 65(0,0)
LFCSP-72_L10.0-W9.8-P0.50-LS10.2-BL-EP5.5
  rect 0.28x0.665 smd: 1(-4.25,-4.907) 2(-3.75,-4.907) 3(-3.25,-4.907) 4(-2.75,-4.907) 5(-2.25,-4.907) 6(-1.75,-4.907) 7(-1.25,-4.907) 8(-0.75,-4.907) 9(-0.25,-4.907) 10(0.25,-4.907) 11(0.75,-4.907) 12(1.25,-4.907) 13(1.75,-4.907) 14(2.25,-4.907) 15(2.75,-4.907) 16(3.25,-4.907) 17(3.75,-4.907) 18(4.25,-4.907) 37(4.25,4.907) 38(3.75,4.907) 39(3.25,4.907) 40(2.75,4.907) 41(2.25,4.907) 42(1.75,4.907) 43(1.25,4.907) 44(0.75,4.907) 45(0.25,4.907) 46(-0.25,4.907) 47(-0.75,4.907) 48(-1.25,4.907) 49(-1.75,4.907) 50(-2.25,4.907) 51(-2.75,4.907) 52(-3.25,4.907) 53(-3.75,4.907) 54(-4.25,4.907)
  rect 0.665x0.28 smd: 19(4.782,-4.25) 20(4.782,-3.75) 21(4.782,-3.25) 22(4.782,-2.75) 23(4.782,-2.25) 24(4.782,-1.75) 25(4.782,-1.25) 26(4.782,-0.75) 27(4.782,-0.25) 28(4.782,0.25) 29(4.782,0.75) 30(4.782,1.25) 31(4.782,1.75) 32(4.782,2.25) 33(4.782,2.75) 34(4.782,3.25) 35(4.782,3.75) 36(4.782,4.25) 55(-4.782,4.25) 56(-4.782,3.75) 57(-4.782,3.25) 58(-4.782,2.75) 59(-4.782,2.25) 60(-4.782,1.75) 61(-4.782,1.25) 62(-4.782,0.75) 63(-4.782,0.25) 64(-4.782,-0.25) 65(-4.782,-0.75) 66(-4.782,-1.25) 67(-4.782,-1.75) 68(-4.782,-2.25) 69(-4.782,-2.75) 70(-4.782,-3.25) 71(-4.782,-3.75) 72(-4.782,-4.25)
  rect 5.3x5.3 smd: 73(0,0)
MSOP-10_L3.0-W3.0-P0.50-LS5.0-BL
  oval 0.28x1.62 smd: 1(-1,-2.11) 2(-0.5,-2.11) 3(0,-2.11) 4(0.5,-2.11) 5(1,-2.11) 6(1,2.11) 7(0.5,2.11) 8(0,2.11) 9(-0.5,2.11) 10(-1,2.11)
OSC-SMD_6P-L3.2-W2.5-BL-1
  rect 0.7x1.05 smd: 1(-1.25,-0.925) 2(0,-0.925) 3(1.25,-0.925) 4(1.25,0.925) 5(0,0.925) 6(-1.25,0.925)
Pad_e7141
  round 3.1 hole 2.7: 1(0,0)
Pad_e7142
  round 3.1 hole 2.7: 1(0,0)
Pad_e7143
  round 3.1 hole 2.7: 1(0,0)
Pad_e7144
  round 3.1 hole 2.7: 1(0,0)
R0603
  rect 0.806x0.864 smd: 1(-0.753,0) 2(0.753,0)
RJ45-TH_HR911130A
  round 1.7 hole 1.1: 11(6.625,6.895) 12(4.085,6.895) 13(-4.085,6.895) 14(-6.625,6.895)
  rect 1.524x1.524 hole 0.91: P1(5.72,-6.895)
  round 1.524 hole 0.91: P2(4.549,-4.355) P3(3.18,-6.895) P4(2.009,-4.355) P5(0.64,-6.895) P6(-0.531,-4.355) P7(-1.9,-6.895) P8(-3.071,-4.355) P9(-4.44,-6.895) P10(-5.611,-4.355)
  round 2.159 hole 1.7: SHIELD0(-7.745,-1.056) SHIELD1(7.745,-1.056)
SC-70-5_L2.1-W1.3-P0.65-LS2.1-BR
  rect 0.9x0.4 smd: 1(1.1,-0.65) 2(1.1,0) 3(1.1,0.65) 4(-1.1,0.65) 5(-1.1,-0.65)
ScopefunPackagesLibrary:GDT_SG
  rect 1.2x4 smd: 1(-2,0) 2(2,0)
SMA-SMD_BWSMA-KE-P001
  rect 4.8x1.2 smd: 1(0,-2.55) 2(0,2.55) 5(0,0)
  rect 4.8x1.2 smd far side: 3(0,2.55) 4(0,-2.55)
SMA_L4.3-W2.6-LS5.0-FD
  rect 1.8x1.62 smd: 1(-2.15,-0.009) 2(2.15,0.009)
SMB_L4.6-W3.6-LS5.3-BI
  rect 2.047x2.4 smd: 1(-2.391,0) 2(2.391,0)
SMD_L4.7-W4.7-D3.0
  round 5 hole 3.2: 1(0,0)
SOD-123F_L2.8-W1.8-LS3.7-RD
  rect 1x1.2 smd: 1(-1.65,0) 2(1.65,0)
SOP-8_L4.9-W3.9-P1.27-LS6.0-BL
  oval 0.63x1.865 smd: 1(-1.905,-2.683) 2(-0.635,-2.683) 3(0.635,-2.683) 4(1.905,-2.683) 5(1.905,2.683) 6(0.635,2.683) 7(-0.635,2.683) 8(-1.905,2.683)
SOT-23-3_L2.9-W1.3-P1.90-LS2.4-BR
  rect 1x0.65 smd: 1(1,-0.95) 2(1,0.95) 3(-1,0)
SOT-23-3_L2.9-W1.6-P1.90-LS2.8-BR
  rect 1.07x0.6 smd: 1(1.235,-0.95) 2(1.235,0.95) 3(-1.235,0)
SOT-23-5_L2.9-W1.6-P0.95-LS2.8-BR
  rect 1x0.6 smd: 1(1.1,-0.95) 2(1.1,0) 3(1.1,0.95) 4(-1.1,0.95) 5(-1.1,-0.95)
SOT-23-5_L3.0-W1.7-P0.95-LS2.8-BR
  rect 1.1x0.6 smd: 1(1.3,-0.95) 2(1.3,0) 3(1.3,0.95) 4(-1.3,0.95) 5(-1.3,-0.95)
SOT-23-6_L2.9-W1.6-P0.95-LS2.8-BL
  rect 0.532x1.072 smd: 1(-0.95,-1.149) 2(0,-1.149) 3(0.95,-1.149) 4(0.95,1.149) 5(0,1.149) 6(-0.95,1.149)
SW-SMD_DSHP02TSGER
  rect 0.762x1.524 smd: 1(-0.635,-3.81) 2(0.635,-3.81) 3(0.635,3.81) 4(-0.635,3.81)
SW-TH_MT-0-102-C004-N004-RS
  round 2.7 hole 1.9: 1(0,10.15) 2(0,6.35) 3(0,2.55) 4(2.5,-10.15) 5(-2.5,-10.15)
TO-252-2_L6.6-W6.1-P4.57-LS9.9-TL-CW
  rect 2.8x1.3 smd: 1(-3.292,2.273) 3(-3.292,-2.273)
  rect 6x6 smd: 2(2.907,0.021)
TSOT-23-5_L2.9-W1.6-P0.95-LS2.8-BL
  rect 0.532x1.045 smd: 1(-0.95,-1.147) 2(0,-1.147) 3(0.95,-1.147) 4(0.95,1.147) 5(-0.95,1.147)
TSSOP-16_L5.0-W4.4-P0.65-LS6.4-BL
  oval 0.343x1.732 smd: 1(-2.275,-2.866) 2(-1.625,-2.866) 3(-0.975,-2.866) 4(-0.325,-2.866) 5(0.325,-2.866) 6(0.975,-2.866) 7(1.625,-2.866) 8(2.275,-2.866) 9(2.275,2.866) 10(1.625,2.866) 11(0.975,2.866) 12(0.325,2.866) 13(-0.325,2.866) 14(-0.975,2.866) 15(-1.625,2.866) 16(-2.275,2.866)
TSSOP-48_L12.6-W6.2-P0.50-LS8.1-BL
  oval 0.28x1.715 smd: 1(-5.75,-3.708) 2(-5.25,-3.708) 3(-4.75,-3.708) 4(-4.25,-3.708) 5(-3.75,-3.708) 6(-3.25,-3.708) 7(-2.75,-3.708) 8(-2.25,-3.708) 9(-1.75,-3.708) 10(-1.25,-3.708) 11(-0.75,-3.708) 12(-0.25,-3.708) 13(0.25,-3.708) 14(0.75,-3.708) 15(1.25,-3.708) 16(1.75,-3.708) 17(2.25,-3.708) 18(2.75,-3.708) 19(3.25,-3.708) 20(3.75,-3.708) 21(4.25,-3.708) 22(4.75,-3.708) 23(5.25,-3.708) 24(5.75,-3.708) 25(5.75,3.708) 26(5.25,3.708) 27(4.75,3.708) 28(4.25,3.708) 29(3.75,3.708) 30(3.25,3.708) 31(2.75,3.708) 32(2.25,3.708) 33(1.75,3.708) 34(1.25,3.708) 35(0.75,3.708) 36(0.25,3.708) 37(-0.25,3.708) 38(-0.75,3.708) 39(-1.25,3.708) 40(-1.75,3.708) 41(-2.25,3.708) 42(-2.75,3.708) 43(-3.25,3.708) 44(-3.75,3.708) 45(-4.25,3.708) 46(-4.75,3.708) 47(-5.25,3.708) 48(-5.75,3.708)
TYPE-C-SMD_TYPE-C-6P
  oval 1.1x1.9 hole 0.7x1.5: 7(-4.32,1.837) 7(-4.32,-1.962) 7(4.32,1.837) 7(4.32,-1.962)
  rect 0.7x1 smd: A5(-0.5,1.962) A9(1.5,1.962) B5(0.5,1.962) B9(-1.5,1.962)
  rect 0.8x1 smd: A12(2.7,1.962) B12(-2.7,1.962)
UQFN-14_L2.5-W2.5-P0.40-BL
  rect 0.2x0.665 smd: 1(-0.4,-1.157) 2(0,-1.157) 3(0.4,-1.157) 8(0.4,1.157) 9(0,1.157) 10(-0.4,1.157)
  rect 0.665x0.2 smd: 4(1.157,-0.6) 5(1.157,-0.2) 6(1.157,0.2) 7(1.157,0.6) 11(-1.157,0.6) 12(-1.157,0.2) 13(-1.157,-0.2) 14(-1.157,-0.6)
USB-C-SMD_TYPE-C-6PIN-2MD-073
  rect 0.55x1.1 smd: 1(-3.2,2.375) 2(-2.4,2.375) 11(2.4,2.375) 12(3.2,2.375)
  rect 0.3x1.1 smd: 3(-1.75,2.375) 4(-1.25,2.375) 5(-0.75,2.375) 6(-0.25,2.375) 7(0.25,2.375) 8(0.75,2.375) 9(1.25,2.375) 10(1.75,2.375)
  oval 1.1x2 hole 0.6x1.5: 13(-4.325,1.825) 14(4.325,1.825)
  oval 1.2x1.8 hole 0.6x1.2: 13(-4.325,-2.375) 14(4.325,-2.375)
VQFN-20_L5.0-W5.0-P0.65-TL-EP
  oval 1.087x0.364 smd: 1(-2.469,1.3) 2(-2.469,0.65) 3(-2.469,0) 4(-2.469,-0.65) 5(-2.469,-1.3) 11(2.469,-1.3) 12(2.469,-0.65) 13(2.469,0) 14(2.469,0.65) 15(2.469,1.3)
  oval 0.364x1.087 smd: 6(-1.3,-2.469) 7(-0.65,-2.469) 8(0,-2.469) 9(0.65,-2.469) 10(1.3,-2.469) 16(1.3,2.469) 17(0.65,2.469) 18(0,2.469) 19(-0.65,2.469) 20(-1.3,2.469)
  rect 3.15x3.15 smd: 21(0,0)
VSSOP-10_L3.0-W3.0-P0.50-LS4.9-BL
  rect 0.3x1.3 smd: 1(-1,-2.35) 2(-0.5,-2.35) 3(0,-2.35) 4(0.5,-2.35) 5(1,-2.35) 6(1,2.35) 7(0.5,2.35) 8(0,2.35) 9(-0.5,2.35) 10(-1,2.35)
WSON-12_L3.0-W3.0-P0.50-TL-EP-2
  rect 0.623x0.25 smd: 1(-1.411,1.25) 2(-1.411,0.75) 3(-1.411,0.25) 4(-1.411,-0.25) 5(-1.411,-0.75) 6(-1.411,-1.25) 7(1.411,-1.25) 8(1.411,-0.75) 9(1.411,-0.25) 10(1.411,0.25) 11(1.411,0.75) 12(1.411,1.25)
  rect 1.3x2.5 smd: 13(0,0)

## Nets
As in the schematic.

Pads without a net: CN3 12 14; NOREF 1; NOREF#2 1; NOREF#3 1; NOREF#4 1; OSC2 2; SW4 3; U2 26 30 62 63 65 66; U3 7 15 18 19 20 24 25 26 28 29 35 36 39 40 42 43 45 46 52 53 55 56; U7 3 9; U8 4 5 6; U17 4; U18 1 3 5 7 9 11 13 15 17 18 19 21 23 24 25 26 27 29; U19 4; U21 4; U22 1 5 8; U24 4; U25 2 3 4 5; U27 1 5 8; U30 11 14; U31 4; U32 4 5 6 9 10; U34 4; U35 4; U37 3 7; U38 3 7; U44 1 5 8; U45 11 14; U47 1 5 8; U49 1 5 8; U50 1 5 8; USB3 3 9; X2 9 10 91 92

## Via types
v1: diameter 0.45, hole 0.3, Top Layer to Bottom Layer, 1684 vias
v2: diameter 0.61, hole 0.305, Top Layer to Bottom Layer, 115 vias
v3: diameter 0.5, hole 0.3, Top Layer to Bottom Layer, 2 vias

## Routing (per net, layer and track width the routed paths; a pad name or vN(x,y) marks a point on that pad's centre or on a via; arc(x,y) is an arc through that point)
0.4V: length 16.5
  Inner2 w0.14: v1(20.95,76.61) 20.7,76.86 20.7,79.77 23.05,82.12 26.72,82.12 v1(27.18,82.58)
  Bottom Layer w0.14: 28.55,82.63 28.55,82.88 29.06,83.39 29.06,84.21 29.35,84.49 U9.1 ; v1(27.18,82.58) 27.19,82.59 U9.4 ; R16.1 R2.2
3.0V: length 46.5
  Top Layer w0.254: R145.1 57.75,40.73 56.2,42.28 51.5,42.28 51.1,41.88 51.1,38.87 51.75,38.21 R144.1 52.16,34.43 52.06,34.33
  Top Layer w0.508: L19.2 54.84,34.33 C155.2 C154.2
  Bottom Layer w0.254: 79.59,69.15 79.86,69.42 79.86,69.95 U40.5 ; 79.59,69.15 79.81,68.93 v2(79.81,68.51) 79.81,67.86 C133.2 ; 79.59,69.15 79.37,68.93 U40.6 ; U40.5 79.83,69.95 ; U40.5 U40.4 80.46,70.48 80.78,70.79 80.78,71.05 80.35,71.48 U40.2 U40.1 79.66,72.15 v2(79.66,72.83) ; v2(79.66,72.83) 79.76,72.93 C130.2 ; v2(79.66,72.83) 79.46,73.03 U40.20 ; U21.3 17.96,69.48 18.76,70.28 19.42,70.28 19.86,69.85 U21.1 v2(20.52,69.17) 21.15,69.17 21.23,69.09 ; U24.3 37.78,77.71 37.78,76.97 37.48,76.66 36.1,76.66 35.86,76.9 35.86,79.13 C97.2
  Bottom Layer w0.381: C69.2 70.45,88.59 v2(70.45,89.04) 70.45,89.68 69.69,89.68 69.46,89.92 69.46,91.25 69.79,91.58 U34.1
  vias: v1(30.42,70.43) v1(31,70.43) v1(38.24,79.83) v2(35.85,78.79) v2(51.25,33.41) v2(52.05,33.41) v2(53.07,33.41)
5.0V: length 49.8
  Top Layer w0.15: FPC1.2 v1(7.02,35.82) C73.1 v1(6.96,35.29) 6.03,35.29 FPC1.1
  Top Layer w0.254: R151.1 52.68,19.99 51.78,20.89 C161.2
  Top Layer w0.381: U35.1 79.08,43.79 C82.2 ; U35.1 80.5,43.79 ; U35.1 80.45,44.61 80.89,45.05 82,45.05 82.35,44.69 82.35,43.79 ; v2(49.92,29.74) 51.83,27.83 L22.1 ; 80.45,43.79 78.88,43.79
  Top Layer w0.508: v2(85.16,11.02) 84.25,10.1 v2(82.99,10.1) v2(82,10.1)
  Bottom Layer w0.102: U32.15 34.51,61.87 34.51,61.88 33.6,61.88 33.37,61.64 33.37,60.77 33.6,60.54 35.34,60.54 U32.13
  Bottom Layer w0.254: U31.1 39.75,97.59 39.32,98.02 39.32,99.05 39.76,99.49 U31.3 ; 26.67,63.2 26.67,63.76 27.18,64.27 28.25,64.27 28.73,63.78 28.73,63.36 U19.1 v2(29.43,63.2) 29.94,63.2 C94.2 ; 18.52,81.34 19.38,81.34 19.73,80.99 19.73,79.87 19.3,79.44 18.52,79.44 18.6,79.35 v2(18.6,78.65) 18.6,78.25 C92.2
  Bottom Layer w0.305: v2(41.2,101.9) 40.44,101.14 U31.3
  Bottom Layer w0.381: U32.15 35.38,62.42 35.59,62.63 v2(36.15,62.63) 36.35,62.83 36.35,64.19 C60.1
  vias: v1(30.55,44.17) v1(30.59,50.04) v1(30.59,48.71) v1(30.59,45.7) v1(30.9,49.42) v1(30.93,44.97) v1(49.87,27.5) v1(50.23,26.27) v1(50.53,28.62) v1(51.35,29.64) v1(53.14,28.06) v2(35.58,62.29) v2(50.59,30.96) v2(52.01,26.17) v2(52.01,24.54) v2(52.17,30.96) v2(52.83,29.64) v2(79.81,43.81) v2(84.09,10.1)
20V-3.0V: length 7.8
  Top Layer w0.254: U26.3 57,38.47 56.05,39.42 U26.5
  Top Layer w0.508: U26.3 57.53,37.84 58.12,37.25 R143.2
20V-5.1V: length 4.2
  Top Layer w0.203: U43.12 61.86,23.78 C159.2
  Top Layer w0.381: C159.2 62.11,24.03 R142.2
20V--5.0V: length 8
  Top Layer w0.254: U42.5 70.45,35.68 69.5,36.63 U42.3
  Top Layer w0.381: C145.2 69.5,38.79 U42.3
  Top Layer w0.508: R147.2 69.25,37.4 U42.3
-5.0V: length 103.2
  Top Layer w0.254: R150.2 68.04,33.09 68.54,32.59 73.99,32.59 74.3,32.9 74.3,33.54 74.2,33.63 74.2,34.27 v1(74.15,34.33)
  Top Layer w0.381: 71.4,39.04 C145.1 ; U42.1 71.4,38.21
  Top Layer w0.508: C147.1 v2(71.22,40.75) 71.4,40.56 v1(71.4,39.94) 71.4,38.21
  Bottom Layer w0.254: 44.41,103.38 44.49,103.46 v2(44.49,104.33) 44.49,104.87 44.49,104.86 43.75,104.86 43.51,105.1 43.51,106.66 43.67,106.82 U38.5 ; v1(71.4,39.94) 73.38,37.96 73.38,35.09 v1(74.15,34.33) ; 71.95,100.49 U37.8 71.94,100.76 71.11,100.76 70.93,100.94 70.93,102.52 71.13,102.71 U37.5
  Bottom Layer w0.635: 72.15,40.68 72.09,40.75 v2(71.22,40.75) ; 72.15,40.68 v1(71.4,39.94) ; 72.15,40.68 72.92,41.46 72.92,44.73 73.94,45.75 76.49,45.75 81.64,50.9 81.64,76.3 78.48,79.46 74.91,79.46 72.92,81.45 72.92,98.22 71.9,99.24 v2(71.9,100.06) 71.9,100.45 71.95,100.49
A1VIN1+: length 7.1
  Top Layer w0.15: R107.2 61.41,83.52 61.41,82.68
  Top Layer w0.158: U1.62 63.04,77.79 63.02,77.81 63.02,78.33 63.13,78.44 63.13,78.74 61.95,79.92 61.95,82.14 61.41,82.68
A1VIN2+: length 7.3
  Top Layer w0.15: R108.2 62.62,83.63 62.62,82.87 C37.1
  Top Layer w0.158: U1.61 63.54,78.35 63.44,78.44 63.44,78.8 62.22,80.02 62.22,82.08 C37.1
A2VIN1+: length 13.6
  Top Layer w0.15: R163.2 78.04,82.5 78.01,82.47
  Top Layer w0.158: 77.62,82.17 77.46,82.01 77.46,81.2 75.42,79.16 68.95,79.16 68.54,78.75 U1.51
A2VIN2+: length 13.8
  Top Layer w0.15: R162.2 76.53,82.55 C68.2
  Top Layer w0.158: U1.52 68.04,78.61 68.89,79.46 75.36,79.46 77.16,81.26 77.16,81.96 76.84,82.28
GND: length 291.9
  Top Layer w0.14: v1(23.35,75.64) 23.86,75.64 U2.5
  Top Layer w0.15: U8.3 72.38,14.78 72.37,14.8 71.95,14.8 v1(71.9,14.85) ; v1(54.27,37.93) 54.36,37.84 U26.1 55.1,38.31 v1(55.24,38.45) ; v1(12.48,77.28) 12.26,77.06 U7.7 ; X2.1 68.53,46.12 v1(68.49,46.16) ; v1(59.97,36.22) 60.04,36.15 v1(60.04,35.3) 60.04,34.45 v1(59.97,34.38) ; X2.49 49.46,45.1 v1(49.46,46.52) ; U43.8 58.52,21.78 v1(58.37,21.63) ; C137.2 27.26,94.48 v1(27.18,94.56) ; R178.2 40.57,83.1 v1(40.28,83.1) ; v1(67.72,40.5) 67.79,40.44 C157.1 ; v1(15.91,79.46) 15.88,79.49 C1.2 15.4,79.53 v1(15.4,80.03) ; X2.8 66.13,48.17 v1(67.42,46.88) ; FPC1.29 v1(5.09,49.32) ; U36.28 56.2,61.54 v1(56.2,60.49) ; X2.2 v1(68.53,48.2) ; LED5.1 54.2,41.38 v1(54.31,41.27) ; v1(50.64,55.19) 50.69,55.13 U36.10 ; X2.4 v1(67.73,48.15) ; U36.4 47.69,55.22 v1(47.68,55.24) ; v1(25.65,77.42) 25.58,77.49 25.58,77.72 ; v1(7.59,34.48) 7.54,34.43 C73.2 8.13,33.9 v2(8.15,33.92) ; v1(41.97,94.69) 41.97,94.11 C164.2 ; X2.67 v1(42.13,43.71) ; v1(51.5,36.27) 51.5,35.83 C154.1 51.37,35.76 v1(50.84,35.76) ; v1(53.34,35.73) C155.1 52.8,36.25 v1(52.78,36.27) ; v1(15.4,77.02) 15.4,77.56 C15.1 15.3,77.53 v1(14.83,77.53) ; R166.2 v1(25.34,82.63) ; v1(58.29,36.52) 58.29,35.67 v1(58.27,35.66) ; v1(8.01,56.31) 7.94,56.38 7.62,56.38 ; v1(22.18,82.63) R165.1 ; U7.4 12.26,81.79 v1(12.41,81.94) ; X2.6 66.93,48.13 v1(67.47,47.59) ; U36.21 56.19,54.68 56.18,54.69 56.18,55.35 56.21,55.38 v1(56.21,55.53) ; X2.3 v1(67.73,46.26) ; v1(16.72,80.13) 16.76,80.09 C14.2 17.25,79.49 v1(17.28,79.46) ; X2.60 45.33,48.21 v1(45.38,48.15) ; X2.82 36.53,48.13 v1(36.56,48.1) ; v1(37.12,83.1) 36.75,82.73 R177.1 ; v2(4.38,33.67) 4.33,33.62 FPC1.42 ; U36.15 v1(53.19,55.14) ; v1(52.52,48) 52.45,48.07 52.44,48.07 52.53,48.16 X2.42 ; X2.7 v1(66.13,43.76) ; X2.5 v1(66.93,43.71)
  Top Layer w0.158: v1(35.34,106.44) 35.34,105.96 R182.1 ; v1(41.51,98.79) 41.55,98.83 R186.1 ; v1(73.27,77.77) 73.63,77.4 R64.2 ; v1(65.79,73.2) 65.11,73.2 62.36,75.95 U1.3
  Top Layer w0.254: v1(20.34,106.49) 20.27,106.42 R170.1 ; U29.3 64.3,13.98 v1(64.36,14.03) ; v1(79.55,55.45) 79.21,55.45 79.15,55.39 79.13,55.39 78.8,55.07 U33.21 ; U33.34 v1(75.8,60.59) ; 74.14,40.1 73.88,40.1 v1(73.23,40.75) ; 74.14,40.1 74.14,40.72 v1(74.05,40.81) ; 74.14,40.1 L17.2 74.14,39.62 ; v1(57.47,110.42) 57.9,110.42 R90.1 ; v1(53.29,6.33) 53.33,6.37 X1.39 53.33,8.66 v1(53.39,8.73) ; v1(33.3,8.73) 33.33,8.7 X1.89 33.33,6.15 v1(33.35,6.13) ; U33.39 73.3,60.72 v1(73.38,60.64) ; v1(60.89,22.45) 60.86,22.41 C158.1 60.23,21.79 v1(60.17,21.73) ; v1(58.85,6.23) 58.93,6.31 X1.25 58.93,8.75 v1(58.9,8.78) ; 53.18,21.77 53.24,21.82 v1(53.24,22.24) ; 53.18,21.77 53.18,21.2 v1(53.2,21.19) ; 53.18,21.77 53.71,21.77 v1(53.75,21.73) ; v1(73.25,55.26) 73.3,55.2 U33.10 ; v1(23.15,74.94) 23.38,74.71 U2.7 ; v1(81.4,44.48) U35.2 v1(81.4,43.2) ; U2.58 31.58,77.61 v1(31.61,77.58) ; v1(54.11,13.11) 54.11,11.88 X1.38 54.13,10.74 v1(53.9,10.51) ; v1(70.68,42.13) 71.2,42.13 C146.2 v1(71.75,42.15) ; v1(78.79,60.59) 78.8,60.6 U33.28 ; v1(62.07,56.02) 61.59,55.54 U39.10 ; v1(82.56,47.41) C83.1 81.95,47.42 v1(81.95,47.89) ; 74.14,39.62 73.58,39.62 v1(73.13,39.17) ; 74.14,39.62 74.14,39.19 v1(74.15,39.17) ; U29.1 61.93,13.32 v1(61.91,13.32) ; U2.2 24.28,77.21 24.32,77.17 24.32,77.17 24.68,76.81 v1(24.78,76.81) ; C159.1 61.29,21.93 v1(61.19,21.83) ; C159.1 v1(62.01,21.07) ; C159.1 62.01,21.93 v1(62.01,21.94) ; 66.04,73.45 69.04,76.45 U1.47 ; 66.04,73.45 U1.56 ; 66.04,73.45 v1(65.79,73.2) ; 14.05,24.72 13.48,24.72 v1(13.41,24.64) ; v1(68.69,39.73) 68.63,39.67 C157.1 v1(67.79,38.82) ; R88.2 36.73,77.87 v1(36.73,77.47) ; R149.1 66.46,34.02 v1(65.89,34.02) ; v1(7.03,56.31) 7.55,56.31 7.62,56.38 ; U43.6 57.06,21.28 57.11,21.22 57.32,21.22 57.47,21.37 57.47,21.67 v1(57.46,21.68) 57.36,21.78 U43.5 ; R148.1 69.65,34.13 v1(69.56,34.23) ; v1(30.08,77.68) 30.08,78.23 U2.61 ; v1(4.33,56.56) 4.28,56.52 FPC1.41 ; v1(33.2,10.56) 33.33,10.69 X1.90 ; U33.45 v1(70.3,60.64) ; R152.2 61.81,20.05 v1(61.24,20.05) ; U2.70 25.59,78.23 ; v1(59.66,13.22) 59.73,13.15 X1.24 59.73,10.68 v1(59.66,10.61) ; 25.58,78.23 25.58,77.72 ; v1(80.37,40.75) 79.92,40.75 C148.1 ; v1(67.06,16.17) 67.02,16.14 U6.1 ; v1(69.15,42.18) 69.66,42.18 C147.2 70.14,42.15 v1(70.17,42.18) ; U33.4 70.3,55.26 v1(70.27,55.29) ; FPC1.11 5.17,40.32 v1(5.14,40.3) ; v1(34.53,74.73) 34.44,74.64 33.89,74.64 33.83,74.71 U2.48 ; 53.18,23.42 53.18,22.96 v1(53.24,22.91) ; 53.18,23.42 v1(53.75,23.42) ; 53.18,23.42 53.19,23.42 v1(53.19,23.98) ; U3.44 v1(46.51,76.86) 46.51,76.16 v1(46.56,76.11) ; v1(5.09,44.78) 5.13,44.82 FPC1.20 ; U2.28 29.08,68.59 29.01,68.52 29.01,68.04 v2(29.32,67.73) ; v1(93.63,37.13) 93.57,37.19 USB2.A12 ; U3.59 47.01,72.08 U3.65 50.01,75.08 U3.37 ; v1(64.81,16.17) 64.85,16.14 U6.3 ; v1(75.83,55.29) 75.8,55.26 U33.15 ; 14.05,26.37 v1(13.51,26.37) ; U2.64 28.58,77.7 v1(28.61,77.68) ; v1(93.94,31.78) 93.92,31.79 USB2.B12 92.8,31.74 v1(93.32,31.22) ; U2.67 v1(27.08,77.73) ; v1(78.18,45.45) 78.75,45.45 C82.1 v1(79.35,45.48)
  Top Layer w0.381: SW1.3 97.31,42.9 v1(96.54,42.13) ; R157.1 v1(79.09,99.25) ; USB3.12 v1(90.98,16.31) ; v1(73.23,110.57) 73.3,110.5 R123.1 ; v1(65.89,81.45) 65.89,80.94 65.73,80.78 ; R146.2 59.91,41.53 v1(59.31,42.13) ; R154.2 v1(75.93,99.3) ; R94.1 v1(65.27,111.95) ; v1(66.31,29.35) 66.31,30.17 D6.2 ; C168.2 42.81,108.1 v1(42.83,108.08) ; SW3.1 92.57,75.55 v1(92.61,75.59) ; X2.31 56.55,45 v1(56.55,46.26) ; D6.2 66.98,30.28 v1(67.02,30.24) ; D6.2 66.29,30.37 v1(66.29,31.37) ; v1(66.8,27.5) 66.83,27.47 C151.2 ; v1(73.99,21.78) 74.84,21.78 LED8.1 ; SW3.1 v1(95.87,75.55) ; R141.1 78.06,29.78 v1(78.08,29.79) ; R174.1 v1(28.04,98.88) ; v1(81.03,112.05) 81.08,112.01 R129.2 ; R124.2 v1(80.47,115.62) ; C149.2 78.01,28.33 v1(78.08,28.26) ; C166.2 27.1,107.62 v1(26.46,107.62) ; v1(96.54,43.41) 97.3,44.17 SW1.4 ; v1(66.5,111.9) 66.55,111.85 R93.2 ; R130.1 82.51,111.47 v1(82.51,112) ; v1(91.13,9.93) 91.8,9.93 USB3.1 ; R99.1 v1(63.44,98.69) ; v1(67.16,81.4) 67.11,81.35 67.11,80.72 ; R96.2 60.23,98.69 v1(60.28,98.74) ; U36.34 v1(53.19,60.44) ; v1(65.48,116.44) 65.48,115.82 65.4,115.75 ; U36.39 v1(50.69,60.44) ; U36.45 v1(47.69,60.49)
  Top Layer w0.508: v2(95.64,20.97) v2(95.64,21.99) 95.64,23.04 v2(95.62,23.06)
  Bottom Layer w0.15: C125.2 47.78,55.9 v1(47.22,55.9) ; v1(17.23,78.85) 17.19,78.81 C92.1 ; C90.1 56.67,75.4 v1(56.65,75.38) ; C92.1 v1(17.74,78.24) ; C92.1 v1(17.19,77.68) ; R29.2 33.46,77.08 v1(32.99,76.61) ; C53.2 26.11,77.69 v1(26.11,77.17) ; v1(41.86,100.37) 41.86,100.87 C80.1 ; v1(64.81,16.17) 64.81,15.47 C28.2 ; v1(27.62,66.77) 27.06,66.77 C93.1 ; 18.52,80.39 18.41,80.28 v1(17.74,80.28) ; C16.2 71.65,15.42 v1(71.69,15.46) ; U31.2 40.89,98.54 v1(41.2,98.23) ; C81.1 v1(43.7,99.05) ; v1(65.12,57.32) C129.2 65.68,57.74 v1(65.43,57.99)
  Bottom Layer w0.152: U40.13 v1(77.33,70.98)
  Bottom Layer w0.158: v1(36.05,99.61) 36.51,99.15 C169.2 ; v1(41.92,103.43) 41.86,103.38 C72.1 ; v1(39.11,107.82) 38.9,107.61 R128.2 ; v1(42.94,102.87) 43.01,102.95 C87.1 ; 45.66,107.69 v1(45.64,107.67)
  Bottom Layer w0.254: v1(30.08,64.22) 30.1,64.23 C94.1 30.56,64.76 v1(30.64,64.67) ; C95.1 21.21,70.64 v1(21.21,70.74) ; C126.2 71.02,55.93 v1(71.04,55.95) ; U32.17 v1(37.19,61.22) U32.21 ; U32.8 v1(37.84,60.3) U32.21 ; U32.7 v1(38.49,59.37) 38.49,59.92 U32.21 ; v1(79.3,55.95) 79.28,55.93 C127.2 ; U32.18 U32.21 ; U32.21 37.86,60.57 v1(38.4,61.1) 38.49,61.2 38.49,61.22 ; C124.2 55.98,56.11 v1(55.58,56.11) ; C122.2 78.67,59.98 v1(78.08,59.98) ; v1(27.89,62.23) 27.62,62.5 U19.2 ; C50.2 26.91,73.8 v1(26.93,73.78) ; v1(81.64,38.82) 81.64,38.24 R131.2 ; v1(37.06,74.4) 37.26,74.2 C98.1 ; C109.1 49.02,65.65 v1(49.02,65.78) ; v1(24.98,81.46) 24.73,81.21 24.73,80.72 ; v1(67.57,55.34) 67.52,55.39 66.99,55.39 ; U9.2 v1(29.88,83.54) ; v1(59.1,110.73) 59.06,110.68 C78.2 ; v1(41.97,60.03) 41.88,60.12 C55.2 v1(41.97,60.58) ; v1(69.71,60.14) 70.41,60.14 C123.2 ; C64.2 34.34,79.75 v1(34.73,79.36) ; U32.12 37.19,59.92 36.54,59.27 U32.11 ; U40.21 77.28,71.48 U40.17 ; U40.21 77.28,70.48 U40.9 ; U40.21 v1(78.27,70.98) U40.3 ; C60.2 v1(38.7,64.57) ; v1(76.85,106.34) 76.81,106.3 C118.2 ; v1(34.42,59.83) 34.4,59.81 C61.2 v1(33.87,59.22) ; R114.2 v1(94.62,31.52) ; v1(63.69,57.53) 64.24,57.53 C128.2 ; v1(36.82,78.5) 36.81,78.49 U24.2 ; C3.1 40.9,71.25 v1(40.95,71.3) ; C167.2 v1(21.52,98.49) ; v1(81.34,38.05) 81.39,38.1 v1(82.31,38.1) ; v1(26.98,75.18) C54.2 ; v1(18.97,68.5) 18.91,68.56 U21.2 ; R113.1 12.5,7.11 v1(12.49,7.09) ; v1(36.46,69.67) 36.38,69.75 35.78,69.75 ; v1(41.66,76) 41.77,75.88 R7.2 ; 38.49,61.22 U32.2 ; 38.49,61.22 U32.19 ; v1(31.05,76.91) 30.99,76.98 C46.2 ; C121.2 v1(55.64,59.74) ; C31.2 32.39,76.92 v1(32.33,76.86) ; C96.1 v1(18.19,73.55) ; U40.8 v1(77.78,70.22) ; v1(45.64,65.76) 45.44,65.96 C106.1 ; C97.1 37.97,79.3 v1(38.04,79.23) ; R134.2 94.72,36.73 v1(95.26,36.73) ; v1(45.64,67.58) 45.49,67.58 C107.1 ; C108.1 45.58,64.57 v1(45.59,64.57) ; C27.2 65.99,15.82 66.34,16.17 v1(67.06,16.17) ; v1(3.77,12.4) 3.77,13.07 C143.2 ; R110.1 v1(13.41,23.06) ; v1(22.98,80.87) 22.09,80.87 C91.1 ; C142.2 v1(3.82,18.57) ; U40.18 v1(77.78,71.84)
  Bottom Layer w0.381: C49.2 62.93,79.96 v1(62.93,80.53) ; v1(77.39,66.74) 77.39,66.53 R86.1 ; C100.2 v1(68.23,79.86) ; v1(75.32,94.25) 75.49,94.25 C175.2 ; C130.1 79.76,76.25 v1(79.71,76.3) ; v1(64.2,80.53) 64.15,80.48 C56.2 ; C17.2 v2(67.52,86.78) ; v1(50.42,64.64) 50.48,64.57 50.72,64.57 51.2,65.05 51.2,65.15 C110.1 ; v1(74.3,111.7) 74.3,111.01 C89.2 ; C59.2 v1(67.56,70.43) ; v1(77.51,75.69) 77.47,75.73 R84.1 ; U34.2 v2(71.45,90.63) ; C134.2 78.36,76.38 v1(78.38,76.4) ; v1(73.79,68.81) 74.28,68.81 C132.2 ; C172.2 59.92,92.88 v1(59.77,93.03) ; C79.2 60.87,105.17 v1(60.43,105.17) ; v1(80.83,93.28) 80.87,93.32 80.87,93.95 ; v1(36.56,109.45) 36.63,109.52 C165.2 ; v1(68.44,71.51) 69.23,71.51 C58.2 ; U37.4 68.38,102.71 v1(68.39,102.72) ; v1(45.64,107.67) 46.25,107.67 46.3,107.72 ; v1(67.57,103.43) 67.57,104.11 67.49,104.19 ; C131.2 74.35,73.45 v1(74.35,74.01) ; v1(48.29,59.83) 48.2,59.74 C120.2 ; v1(59.71,93.85) 60.02,94.15 C173.2 ; v1(21.97,109.5) 21.7,109.78 C163.2 ; v2(68.03,88.44) 68.81,88.44 C69.1 v2(68.86,88.9) ; v1(70.53,98.69) 70.53,99.21 C85.1 70.53,99.26 v1(70.53,99.81) ; v1(62.99,70.22) 62.99,69.59 ; U38.4 40.03,106.88 v1(40.03,107.51) ; v1(65.12,94.15) 65.12,93.66 C170.2 ; v1(61.14,79.97) 61.21,79.91 C99.2 ; v1(68.95,98.69) 68.96,98.71 C86.1 69,99.27 v1(69,99.76) ; C57.2 v1(69.25,80.64) ; U5.2 v2(68.77,81.91) ; v1(73.13,100.53) 73.17,100.57 C71.1 74.14,100.57 v1(74.15,100.58) ; C84.1 v2(66.91,90.58) ; v1(78.33,66.82) 78.36,66.79 C135.1 ; v1(75.32,92.91) 75.62,92.91 C174.2 ; R63.2 65.38,81.9 v1(65.38,82.47) ; C133.1 79.63,66.78 v1(79.5,66.9) ; v1(64.39,70.22) C48.2
  Bottom Layer w0.508: R121.1 v2(96.03,14.8) ; v1(45.64,70.95) 45.64,70.84 45.06,70.27 C10.1 ; C20.2 30.02,85.65 v1(30.08,85.58) ; R120.1 v2(96.13,11.84) ; C9.1 47.41,70.66 v1(47.42,70.67)
  vias: v1(0.63,115.22) v1(0.63,114.45) v1(0.63,113.69) v1(0.63,112.97) v1(0.63,112.21) v1(0.63,111.44) v1(0.63,110.62) v1(0.63,109.86) v1(0.63,109.09) v1(0.63,108.28) v1(0.63,107.52) v1(0.63,106.75) v1(0.63,105.88) v1(0.63,105.12) v1(0.63,104.35) v1(0.63,103.59) v1(0.63,102.82) v1(0.63,102.06) v1(0.63,101.24) v1(0.63,100.48) v1(0.63,99.71) v1(0.63,98.89) v1(0.63,98.13) v1(0.63,97.36) v1(0.63,96.5) v1(0.63,95.74) v1(0.63,94.97) v1(0.63,94.02) v1(0.63,93.28) v1(0.63,92.57) v1(0.63,91.62) v1(0.63,90.89) v1(0.63,90.17) v1(0.63,89.28) v1(0.63,88.54) v1(0.63,87.83) v1(0.63,86.93) v1(0.63,86.2) v1(0.63,85.48) v1(0.63,84.64) v1(0.63,83.9) v1(0.63,83.19) v1(0.63,82.24) v1(0.63,81.5) v1(0.63,80.79) v1(0.63,79.89) v1(0.63,79.16) v1(0.63,78.44) v1(0.63,77.55) v1(0.63,76.81) v1(0.63,76.1) v1(0.63,75.31) v1(0.63,74.57) v1(0.63,73.85) v1(0.68,73.04) v1(0.68,72.3) v1(0.68,71.58) v1(0.68,70.79) v1(0.68,70.05) v1(0.68,69.34) v1(0.63,59.44) v1(0.63,58.71) v1(0.63,57.99) v1(0.63,57.05) v1(0.63,56.31) v1(0.63,55.6) v1(0.63,54.7) v1(0.63,53.96) v1(0.63,53.25) v1(0.63,52.36) v1(0.63,51.62) v1(0.63,50.9) v1(0.63,50.06) v1(0.63,49.32) v1(0.63,48.61) v1(0.63,47.66) v1(0.63,46.93) v1(0.63,46.21) v1(0.63,45.32) v1(0.63,44.58) v1(0.63,43.87) v1(0.63,42.97) v1(0.63,42.23) v1(0.63,41.52) v1(0.63,40.73) v1(0.63,39.99) v1(0.63,39.28) v1(0.68,38.48) v1(0.68,37.75) v1(0.68,37.03) v1(0.68,36.09) v1(0.68,35.35) v1(0.68,34.63) v1(0.68,33.74) v1(0.68,33) v1(0.68,32.29) v1(0.68,31.39) v1(0.68,30.66) v1(0.68,29.94) v1(0.68,29.1) v1(0.68,28.36) v1(0.68,27.65) v1(0.68,26.7) v1(0.68,25.97) v1(0.68,25.25) v1(0.68,24.36) v1(0.68,23.62) v1(0.68,22.91) v1(0.68,22.01) v1(0.68,21.27) v1(0.68,20.56) v1(0.68,19.77) v1(0.68,19.03) v1(0.68,18.31) v1(0.66,17.6) v1(0.66,16.89) v1(0.66,16.1) v1(0.66,15.25) v1(0.66,14.41) v1(0.66,13.63) v1(0.66,12.68) v1(0.66,11.69) v1(0.66,10.54) v1(0.66,9.43) v1(0.66,8.25) v1(0.66,7.03) v1(0.66,5.79) v1(0.73,68.55) v1(0.73,67.81) v1(1.19,115.57) v1(1.19,114.86) v1(1.19,114.12) v1(1.19,113.33) v1(1.19,112.61) v1(1.19,111.88) v1(1.19,110.98) v1(1.19,110.27) v1(1.19,109.53) v1(1.19,108.64) v1(1.19,107.92) v1(1.19,107.19) v1(1.19,106.24) v1(1.19,105.53) v1(1.19,104.79) v1(1.19,103.94) v1(1.19,103.23) v1(1.19,102.49) v1(1.19,101.6) v1(1.19,100.88) v1(1.19,100.15) v1(1.19,99.25) v1(1.19,98.54) v1(1.19,97.8) v1(1.19,96.86) v1(1.19,96.14) v1(1.19,95.4) v1(1.19,94.46) v1(1.19,93.69) v1(1.19,92.93) v1(1.19,92.06) v1(1.19,91.29) v1(1.19,90.53) v1(1.19,89.72) v1(1.19,88.95) v1(1.19,88.19) v1(1.19,87.37) v1(1.19,86.6) v1(1.19,85.84) v1(1.19,85.07) v1(1.19,84.31) v1(1.19,83.54) v1(1.19,82.68) v1(1.19,81.91) v1(1.19,81.15) v1(1.19,80.33) v1(1.19,79.56) v1(1.19,78.8) v1(1.19,77.98) v1(1.19,77.22) v1(1.19,76.45) v1(1.19,75.74) v1(1.19,74.97) v1(1.19,74.21) v1(1.24,73.47) v1(1.24,72.7) v1(1.24,71.94) v1(1.24,71.23) v1(1.24,70.46) v1(1.24,69.7) v1(1.19,59.88) v1(1.19,59.11) v1(1.19,58.35) v1(1.19,57.48) v1(1.19,56.72) v1(1.19,55.95) v1(1.19,55.14) v1(1.19,54.37) v1(1.19,53.61) v1(1.19,52.79) v1(1.19,52.02) v1(1.19,51.26) v1(1.19,50.5) v1(1.19,49.73) v1(1.19,48.97) v1(1.19,48.1) v1(1.19,47.33) v1(1.19,46.57) v1(1.19,45.75) v1(1.19,44.99) v1(1.19,44.22) v1(1.19,43.41) v1(1.19,42.64) v1(1.19,41.88) v1(1.19,41.16) v1(1.19,40.4) v1(1.19,39.63) v1(1.24,38.92) v1(1.24,38.15) v1(1.24,37.39) v1(1.24,36.52) v1(1.24,35.75) v1(1.24,34.99) v1(1.24,34.18) v1(1.24,33.41) v1(1.24,32.65) v1(1.24,31.83) v1(1.24,31.06) v1(1.24,30.3) v1(1.24,29.53) v1(1.24,28.77) v1(1.24,28) v1(1.24,27.14) v1(1.24,26.37) v1(1.24,25.61) v1(1.24,24.79) v1(1.24,24.02) v1(1.24,23.26) v1(1.24,22.45) v1(1.29,68.98) v1(1.29,68.22) v1(1.29,67.45) v1(2.95,66.41) v1(2.95,61.31) v1(6.39,1.31) v1(6.75,0.75) v1(7.11,1.31) v1(7.51,0.75) v1(7.85,1.31) v1(8.28,0.75) v1(8.37,118.8) v1(8.74,1.31) v1(9.1,0.75) v1(9.45,1.31) v1(9.86,0.75) v1(10.19,1.31) v1(10.63,0.75) v1(11.09,1.31) v1(11.44,0.75) v1(11.8,1.31) v1(12.21,0.75) v1(12.54,1.31) v1(12.97,0.75) v1(13.47,118.8) v1(13.48,1.31) v1(13.84,0.75) v1(14.2,1.31) v1(14.6,0.75) v1(14.93,1.31) v1(15.37,0.75) v1(15.63,121.05) v1(15.85,1.36) v1(16.06,120.49) v1(16.21,0.8) v1(16.39,121.05) v1(16.57,1.36) v1(16.8,120.49) v1(16.97,0.8) v1(17.16,121.05) v1(17.31,1.36) v1(17.51,120.49) v1(17.74,0.8) v1(17.87,121.05) v1(18.2,1.36) v1(18.31,120.49) v1(18.56,0.8) v1(18.64,121.05) v1(18.91,1.36) v1(19.04,120.49) v1(19.32,0.8) v1(19.4,121.05) v1(19.65,1.36) v1(19.76,120.49) v1(20.09,0.8) v1(20.55,1.36) v1(20.9,0.8) v1(21.26,1.36) v1(21.31,78.39) v1(21.68,81.57) v1(21.67,0.8) v1(21.83,118.45) v1(22,1.36) v1(22.43,0.8) v1(22.94,1.36) v1(23.35,78.75) v1(23.3,0.8) v1(23.66,1.36) v1(24.06,0.8) v1(24.39,1.36) v1(24.83,0.8) v1(25.34,1.36) v1(25.7,0.8) v1(25.82,81.46) v1(26.05,1.36) v1(26.48,71.15) v1(26.46,0.8) v1(26.51,72.38) v1(26.79,1.36) v1(26.93,118.67) v1(26.97,75.89) v1(27.02,72.78) v1(27.18,79.83) v1(27.23,0.8) v1(27.3,71.17) v1(27.69,1.36) v1(27.79,81.46) v1(27.84,75.84) v1(27.79,75.13) v1(28.04,0.8) v1(28.35,73.96) v1(28.35,72.91) v1(28.45,71.09) v1(28.4,1.36) v1(28.66,118.16) v1(28.66,75.84) v1(28.71,75.13) v1(28.81,0.8) v1(29.14,1.36) v1(29.37,73.91) v1(29.37,72.99) v1(29.47,75.79) v1(29.42,75.03) v1(29.57,0.8) v1(29.65,121) v1(29.72,81.46) v1(29.72,79.83) v1(30.09,120.44) v1(30.03,1.36) v1(30.14,75.08) v1(30.29,75.74) v1(30.29,71.25) v1(30.42,121) v1(30.39,73.96) v1(30.39,72.98) v1(30.39,0.8) v1(30.7,72.43) v1(30.75,1.36) v1(30.82,120.44) v1(31,79.82) v1(31.18,121) v1(31.15,75.59) v1(31.14,74.9) v1(31.14,74.24) v1(31.15,73.19) v1(31.1,10.21) v1(31.15,0.8) v1(31.21,71.1) v1(31.48,1.36) v1(31.54,120.44) v1(31.89,121) v1(31.92,0.8) v1(32.18,81.46) v1(32.33,120.44) v1(32.43,1.36) v1(32.66,121) v1(32.79,0.8) v1(33.07,120.44) v1(33.09,9.76) v1(33.14,1.36) v1(33.42,121) v1(33.55,0.8) v1(33.78,120.44) v1(33.88,1.36) v1(34.32,0.8) v1(34.76,81.46) v1(34.83,1.36) v1(35.18,0.8) v1(35.54,1.36) v1(35.95,0.8) v1(36.28,1.36) v1(36.71,61.87) v1(36.71,0.8) v1(36.82,118.54) v1(36.82,60.29) v1(36.97,81.46) v1(37.17,1.36) v1(37.27,59.31) v1(37.53,0.8) v1(37.69,61.88) v1(37.89,1.36) v1(38.29,0.8) v1(38.62,1.36) v1(38.76,61.83) v1(38.91,60.29) v1(39.06,0.8) v1(39.26,81.46) v1(39.52,1.36) v1(39.88,0.8) v1(40.28,72.52) v1(40.23,1.36) v1(40.39,81.46) v1(40.39,79.83) v1(40.64,0.8) v1(40.97,1.36) v1(41.41,0.8) v1(41.82,105.84) v1(41.92,118.54) v1(41.97,105.22) v1(41.92,1.36) v1(42.27,0.8) v1(42.68,105.84) v1(42.61,105.22) v1(42.68,83.1) v1(42.68,81.46) v1(42.63,1.36) v1(42.73,79.46) v1(43.04,0.8) v1(43.24,118.43) v1(43.37,1.36) v1(43.8,85.64) v1(43.8,84.31) v1(43.8,0.8) v1(44.13,121.05) v1(44.26,87.11) v1(44.31,1.36) v1(44.57,120.49) v1(44.67,0.8) v1(44.9,121.05) v1(45.03,1.36) v1(45.31,120.49) v1(45.33,85.73) v1(45.33,84.53) v1(45.33,83.75) v1(45.43,0.8) v1(45.66,121.05) v1(45.61,76.11) v1(45.74,74.06) v1(45.74,71.41) v1(45.76,1.36) v1(45.89,88.08) v1(46.02,120.49) v1(46.18,79.68) v1(46.19,75.44) v1(46.25,86.55) v1(46.2,83.1) v1(46.21,81.46) v1(46.2,0.8) v1(46.38,121.05) v1(46.56,74.8) v1(46.51,73.04) v1(46.56,71.15) v1(46.66,1.36) v1(46.81,120.49) v1(47.02,0.8) v1(47.15,121.05) v1(47.14,75.44) v1(47.22,71.41) v1(47.37,1.36) v1(47.48,74.06) v1(47.55,120.49) v1(47.49,88.08) v1(47.53,76.1) v1(47.78,0.8) v1(47.83,86.55) v1(47.91,121.05) v1(47.98,75.13) v1(47.96,73.05) v1(47.93,71.15) v1(48.11,1.36) v1(48.27,120.49) v1(48.39,79.83) v1(48.52,75.92) v1(48.55,71.41) v1(48.55,0.8) v1(48.6,70.79) v1(48.7,74.06) v1(49.08,121) v1(49.02,74.6) v1(49.01,1.36) v1(49.27,71.12) v1(49.38,73.09) v1(49.36,0.8) v1(49.52,120.44) v1(49.54,88.08) v1(49.68,86.55) v1(49.67,79.83) v1(49.62,75.95) v1(49.72,1.36) v1(49.85,121) v1(49.83,75.14) v1(49.84,71.39) v1(49.87,70.74) v1(50.08,74.06) v1(50.12,0.8) v1(50.25,120.44) v1(50.4,76.8) v1(50.41,71.12) v1(50.46,1.36) v1(50.51,75.86) v1(50.61,121) v1(50.77,73.02) v1(50.87,75.02) v1(50.97,120.44) v1(50.89,0.8) v1(50.99,71.41) v1(51.05,70.79) v1(51.1,88.08) v1(51.33,121) v1(51.4,1.36) v1(51.76,120.44) v1(51.72,86.55) v1(51.76,0.8) v1(52.09,121) v1(52.12,1.36) v1(52.5,120.44) v1(52.52,0.8) v1(52.68,87.67) v1(52.71,85.67) v1(52.86,121) v1(52.85,1.36) v1(53.21,120.44) v1(53.29,0.8) v1(53.7,84.67) v1(53.85,1.36) v1(54.05,43.51) v1(54.18,121) v1(54.21,86.2) v1(54.21,0.8) v1(54.56,83.8) v1(54.56,1.36) v1(54.62,120.44) v1(54.95,121) v1(54.97,0.8) v1(55.18,85.28) v1(55.35,120.44) v1(55.33,82.73) v1(55.3,1.36) v1(55.71,121) v1(55.74,0.8) v1(56.07,120.44) v1(56.25,81.91) v1(56.2,47.39) v1(56.2,1.36) v1(56.43,121) v1(56.4,84) v1(56.45,80.99) v1(56.45,79.84) v1(56.4,78.34) v1(56.49,77.22) v1(56.55,0.8) v1(56.86,120.44) v1(56.91,1.36) v1(57.19,121) v1(57.32,0.8) v1(57.41,47.17) v1(57.46,23.3) v1(57.46,22.53) v1(57.57,82.78) v1(57.6,120.44) v1(57.65,1.36) v1(57.78,79.31) v1(57.83,81.71) v1(57.83,80.59) v1(57.96,121) v1(58.03,77.63) v1(58.08,0.8) v1(58.31,120.44) v1(58.33,54.67) v1(58.37,23.31) v1(58.37,22.55) v1(58.39,75.12) v1(58.54,1.36) v1(58.9,0.8) v1(59.26,1.36) v1(59.36,53.96) v1(59.66,0.8) v1(59.99,1.36) v1(60.43,0.8) v1(60.94,1.36) v1(61.2,119.05) v1(61.3,0.8) v1(61.45,81.45) v1(61.65,1.36) v1(62.06,0.8) v1(62.27,76.71) v1(62.27,76) v1(62.37,74.72) v1(62.39,1.36) v1(62.58,72.42) v1(62.57,71.36) v1(62.72,81.4) v1(62.82,75.38) v1(62.83,0.8) v1(63.08,76.71) v1(63.08,76.01) v1(63.03,64.06) v1(63.23,74.72) v1(63.21,73.2) v1(63.44,1.36) v1(63.64,71.76) v1(63.69,75.38) v1(63.8,0.8) v1(63.9,64.93) v1(64,76.71) v1(64,76.02) v1(64.1,72.78) v1(64.15,1.36) v1(64.3,62.79) v1(64.41,74.72) v1(64.56,65.69) v1(64.54,53.54) v1(64.56,0.8) v1(64.66,71.1) v1(64.87,76.39) v1(64.98,73.2) v1(64.89,1.36) v1(65.12,72.27) v1(65.12,63.5) v1(65.27,75.43) v1(65.33,0.8) v1(65.64,64.06) v1(65.79,76.39) v1(65.79,74) v1(65.79,71.55) v1(65.79,70.38) v1(65.78,1.36) v1(66.14,0.8) v1(66.3,119.05) v1(66.55,74.26) v1(66.5,1.36) v1(66.72,76.39) v1(66.72,69.85) v1(66.9,0.8) v1(67.01,72.53) v1(67.01,71.25) v1(67.21,74.92) v1(67.23,1.36) v1(67.67,0.8) v1(68.08,118.8) v1(67.99,76.21) v1(68.17,75.4) v1(68.18,74.01) v1(68.13,46.92) v1(68.13,1.36) v1(68.21,73.2) v1(68.23,72.27) v1(68.24,69.85) v1(68.44,47.54) v1(68.49,0.8) v1(68.82,120.95) v1(68.84,1.36) v1(68.89,76.13) v1(69.25,120.39) v1(69.2,101.24) v1(69.25,0.8) v1(69.3,102.36) v1(69.59,120.95) v1(69.58,1.36) v1(69.75,101.74) v1(69.99,120.39) v1(70.02,102.36) v1(70.07,101.19) v1(70.02,0.8) v1(70.35,120.95) v1(70.53,1.36) v1(70.71,120.39) v1(70.88,0.8) v1(71.06,120.95) v1(71.24,1.36) v1(71.5,120.39) v1(71.65,0.8) v1(71.83,120.95) v1(71.98,1.36) v1(72.24,120.39) v1(72.41,0.8) v1(72.59,120.95) v1(72.67,39.94) v1(72.95,120.39) v1(72.98,1.41) v1(73.33,0.85) v1(73.43,120.95) v1(73.69,1.41) v1(73.79,120.37) v1(74.14,40.03) v1(74.09,0.85) v1(74.3,120.98) v1(74.43,1.41) v1(74.71,120.37) v1(74.86,0.85) v1(75.22,121.03) v1(75.32,1.41) v1(75.68,120.37) v1(75.68,0.85) v1(76.03,1.41) v1(76.39,81.2) v1(76.44,0.85) v1(76.77,1.41) v1(76.88,118.92) v1(76.9,71.81) v1(76.95,70.23) v1(77.21,0.85) v1(77.41,80.43) v1(77.67,1.41) v1(78.02,0.85) v1(78.38,1.41) v1(78.58,71.81) v1(78.64,70.18) v1(78.79,0.85) v1(79.12,1.41) v1(79.55,0.85) v1(81.39,36.88) v1(81.98,118.92) v1(81.93,37.47) v1(81.95,36.37) v1(81.95,0.85) v1(82.51,36.88) v1(82.61,1.41) v1(82.97,0.85) v1(83.33,1.41) v1(83.49,118.41) v1(83.73,0.85) v1(84.06,1.41) v1(84.5,0.85) v1(84.68,120.95) v1(85.12,120.39) v1(85.45,120.95) v1(85.85,120.39) v1(86.21,120.95) v1(86.57,120.39) v1(86.85,0.85) v1(86.92,120.95) v1(87.36,120.39) v1(87.31,1.41) v1(87.66,0.85) v1(87.69,120.95) v1(88.02,1.41) v1(88.1,120.39) v1(88.45,120.95) v1(88.43,0.85) v1(88.76,1.41) v1(88.81,120.39) v1(89.27,121) v1(89.19,0.85) v1(89.71,120.44) v1(89.7,1.41) v1(90.04,121) v1(90.06,0.85) v1(90.44,120.44) v1(90.42,1.41) v1(90.8,121) v1(90.82,0.85) v1(91.16,120.44) v1(91.15,1.41) v1(91.51,121) v1(91.59,0.85) v1(91.95,120.44) v1(92,1.43) v1(92.28,121) v1(92.51,0.87) v1(92.69,120.44) v1(93.04,121) v1(93.4,120.44) v1(94.89,28.32) v1(94.89,26.27) v1(95.71,27.92) v1(95.71,27.29) v1(95.72,26.58) v1(96.57,28.31) v1(96.57,26.27) v1(97.74,115.47) v1(97.74,114.76) v1(97.74,113.86) v1(97.74,113.12) v1(97.74,112.41) v1(97.74,111.57) v1(97.74,110.83) v1(97.74,110.12) v1(97.74,109.17) v1(97.74,108.43) v1(97.74,107.72) v1(97.74,106.82) v1(97.74,106.09) v1(97.74,105.37) v1(97.74,104.48) v1(97.74,103.74) v1(97.74,103.03) v1(97.74,102.23) v1(97.74,101.5) v1(97.74,100.78) v1(97.74,99.99) v1(97.74,99.25) v1(97.74,98.54) v1(97.74,97.59) v1(97.74,96.86) v1(97.74,96.14) v1(97.74,95.25) v1(97.74,94.51) v1(97.74,93.8) v1(97.74,92.9) v1(97.74,92.16) v1(97.74,91.45) v1(97.74,90.61) v1(97.74,89.87) v1(97.74,89.15) v1(97.74,88.21) v1(97.74,87.47) v1(97.74,86.76) v1(97.74,85.86) v1(97.74,85.12) v1(97.74,84.41) v1(97.74,83.52) v1(97.74,82.78) v1(97.74,82.06) v1(97.74,81.27) v1(97.74,80.53) v1(97.74,79.82) v1(97.74,78.88) v1(97.74,78.14) v1(97.74,77.42) v1(97.74,76.53) v1(97.74,75.79) v1(97.74,75.08) v1(97.74,74.18) v1(97.74,73.45) v1(97.74,72.73) v1(97.74,71.89) v1(97.74,71.15) v1(97.74,70.44) v1(97.74,69.49) v1(97.74,68.75) v1(97.74,68.04) v1(97.74,67.14) v1(97.74,66.41) v1(97.74,65.69) v1(97.74,64.8) v1(97.74,64.06) v1(97.74,63.35) v1(97.74,62.5) v1(97.74,61.77) v1(97.74,61.05) v1(97.74,60.11) v1(97.74,59.37) v1(97.74,58.66) v1(97.74,57.76) v1(97.74,57.03) v1(97.74,56.31) v1(97.74,55.42) v1(97.74,54.68) v1(97.74,53.97) v1(97.74,53.12) v1(97.74,52.38) v1(97.74,51.67) v1(97.74,50.72) v1(97.74,49.99) v1(97.74,49.27) v1(97.74,48.38) v1(97.74,47.64) v1(97.74,46.93) v1(97.74,46.03) v1(97.74,45.29) v1(97.74,44.58) v1(97.84,43.12) v1(97.84,42.39) v1(97.84,41.67) v1(97.84,40.73) v1(97.84,39.99) v1(97.84,37.64) v1(97.84,36.93) v1(97.84,36.03) v1(97.84,35.3) v1(97.84,34.58) v1(97.84,33.74) v1(97.84,33) v1(97.84,32.29) v1(97.84,31.34) v1(97.84,29) v1(97.84,28.26) v1(97.84,27.55) v1(97.84,26.65) v1(97.84,25.91) v1(97.84,25.2) v1(97.84,24.36) v1(97.84,23.62) v1(97.84,22.91) v1(97.84,21.96) v1(97.84,21.22) v1(97.84,20.51) v1(97.84,19.61) v1(97.84,18.88) v1(97.84,18.16) v1(97.84,17.27) v1(97.84,16.53) v1(97.84,15.82) v1(97.89,14.92) v1(97.89,14.18) v1(97.89,13.47) v1(97.89,12.52) v1(97.89,11.79) v1(97.89,11.07) v1(97.89,10.18) v1(97.89,9.44) v1(97.89,8.73) v1(97.89,7.83) v1(97.89,7.09) v1(97.89,6.38) v1(98.3,116.64) v1(98.3,115.88) v1(98.3,115.11) v1(98.3,114.3) v1(98.3,113.53) v1(98.3,112.77) v1(98.3,112) v1(98.3,111.23) v1(98.3,110.47) v1(98.3,109.61) v1(98.3,108.84) v1(98.3,108.08) v1(98.3,107.26) v1(98.3,106.49) v1(98.3,105.73) v1(98.3,104.91) v1(98.3,104.15) v1(98.3,103.38) v1(98.3,102.67) v1(98.3,101.9) v1(98.3,101.14) v1(98.3,100.42) v1(98.3,99.66) v1(98.3,98.89) v1(98.3,98.03) v1(98.3,97.26) v1(98.3,96.5) v1(98.3,95.68) v1(98.3,94.91) v1(98.3,94.15) v1(98.3,93.34) v1(98.3,92.57) v1(98.3,91.81) v1(98.3,91.04) v1(98.3,90.27) v1(98.3,89.51) v1(98.3,88.64) v1(98.3,87.88) v1(98.3,87.11) v1(98.3,86.3) v1(98.3,85.53) v1(98.3,84.77) v1(98.3,83.95) v1(98.3,83.18) v1(98.3,82.42) v1(98.3,81.71) v1(98.3,80.94) v1(98.3,80.18) v1(98.3,79.31) v1(98.3,78.54) v1(98.3,77.78) v1(98.3,76.97) v1(98.3,76.2) v1(98.3,75.44) v1(98.3,74.62) v1(98.3,73.85) v1(98.3,73.09) v1(98.3,72.32) v1(98.3,71.56) v1(98.3,70.79) v1(98.3,69.93) v1(98.3,69.16) v1(98.3,68.4) v1(98.3,67.58) v1(98.3,66.81) v1(98.3,66.05) v1(98.3,65.23) v1(98.3,64.47) v1(98.3,63.7) v1(98.31,62.94) v1(98.31,62.17) v1(98.31,61.41) v1(98.31,60.54) v1(98.31,59.78) v1(98.31,59.01) v1(98.31,58.2) v1(98.31,57.43) v1(98.31,56.67) v1(98.31,55.85) v1(98.31,55.08) v1(98.31,54.32) v1(98.3,53.56) v1(98.3,52.79) v1(98.3,52.03) v1(98.3,51.16) v1(98.3,50.39) v1(98.3,49.63) v1(98.3,48.81) v1(98.3,48.05) v1(98.3,47.28) v1(98.3,46.47) v1(98.3,45.7) v1(98.3,44.94) v1(98.4,43.56) v1(98.4,42.79) v1(98.4,42.03) v1(98.4,41.16) v1(98.4,40.4) v1(98.4,39.63) v1(98.4,38.82) v1(98.4,38.05) v1(98.4,37.29) v1(98.4,36.47) v1(98.4,35.7) v1(98.4,34.94) v1(98.4,34.18) v1(98.4,33.41) v1(98.4,32.65) v1(98.4,31.78) v1(98.4,31.01) v1(98.4,30.25) v1(98.4,29.43) v1(98.4,28.67) v1(98.4,27.9) v1(98.4,27.09) v1(98.4,26.32) v1(98.4,25.56) v1(98.4,24.79) v1(98.4,24.02) v1(98.4,23.26) v1(98.4,22.4) v1(98.4,21.63) v1(98.4,20.87) v1(98.4,20.05) v1(98.4,19.28) v1(98.4,18.52) v1(98.4,17.7) v1(98.4,16.94) v1(98.4,16.17) v1(98.45,15.36) v1(98.45,14.59) v1(98.45,13.83) v1(98.45,12.96) v1(98.45,12.19) v1(98.45,11.43) v1(98.45,10.61) v1(98.45,9.85) v1(98.45,9.08) v1(98.45,8.27) v1(98.45,7.5) v1(98.45,6.74) v2(94.45,21.99) v2(96.63,21.99)
